# Altium schematic sheet ZYNQ_Schematic.SchDoc
size D; SheetNumber: 1; SheetTotal: 1; SPICEModelCacheHDNJRWBG: <root> / <DocumentId>HDNJRWBG</DocumentId> / </root>
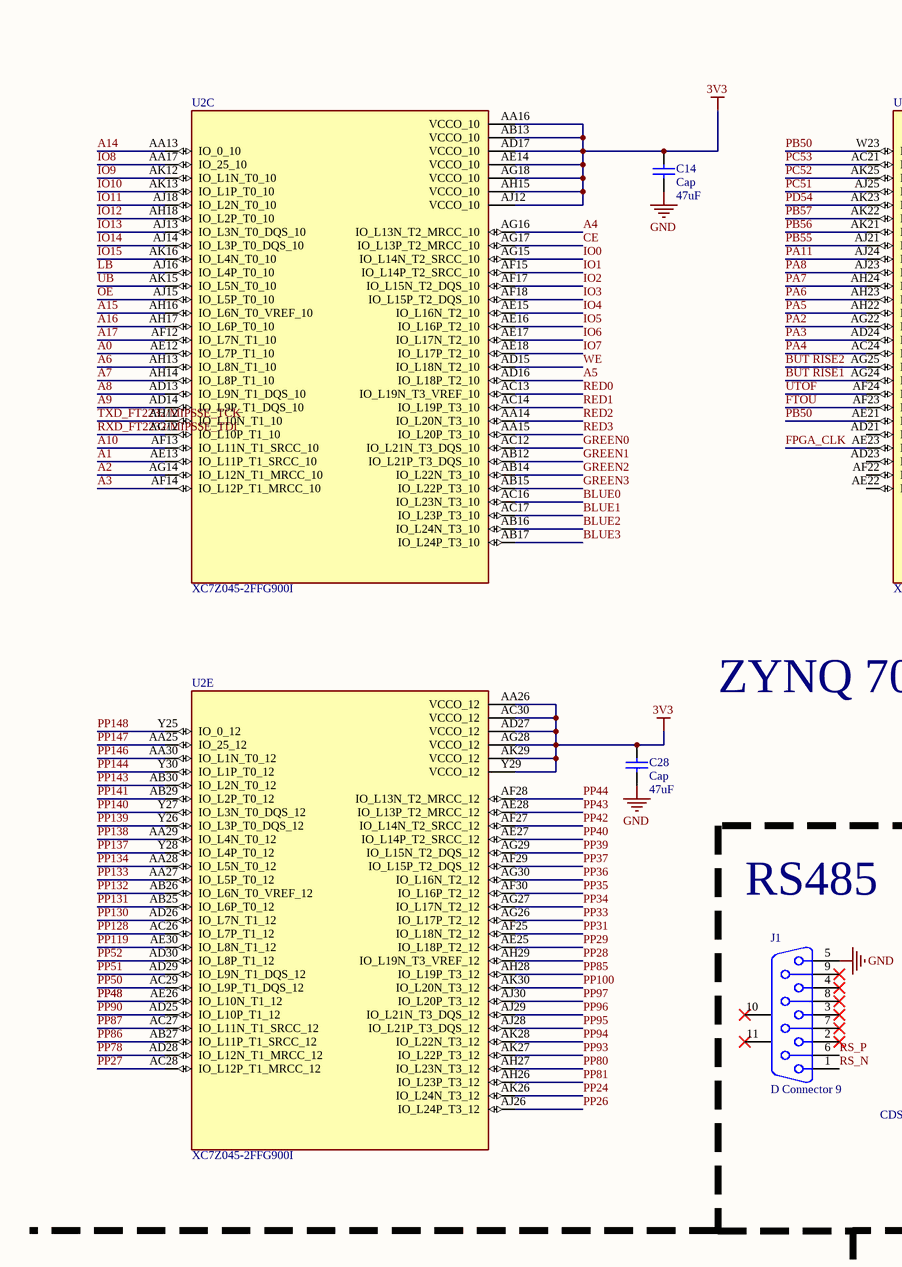
[diagram p0: ZYNQ_Schematic.SchDoc, top left]
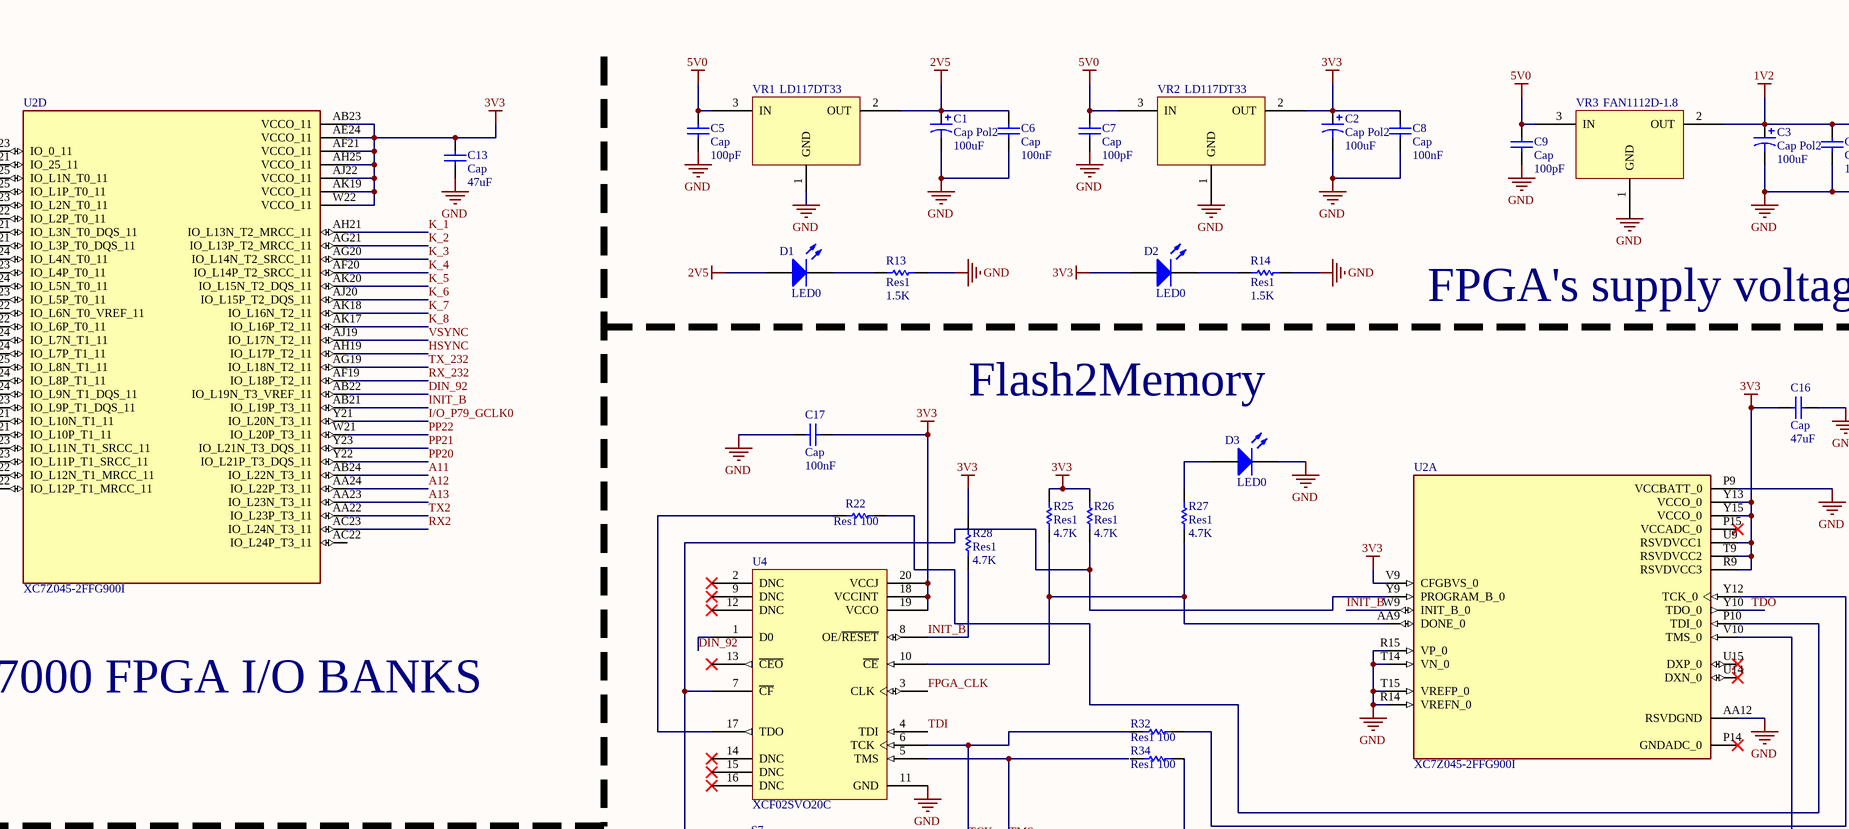
[diagram p1: ZYNQ_Schematic.SchDoc, top middle]
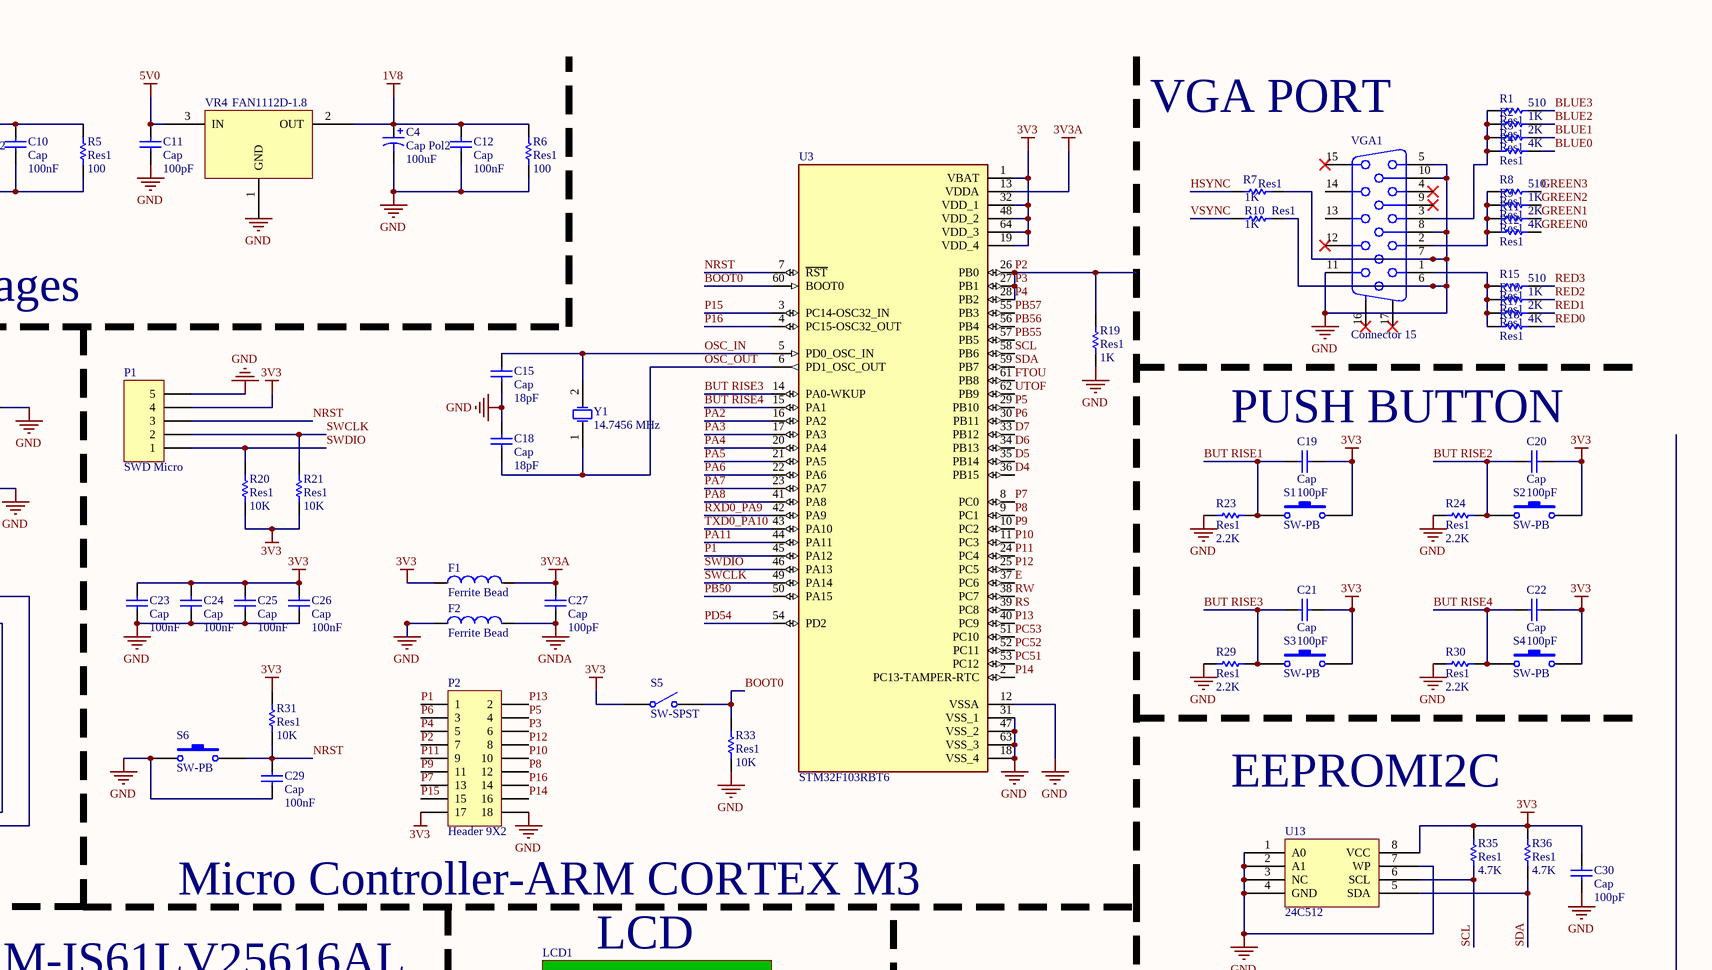
[diagram p2: ZYNQ_Schematic.SchDoc, top right]
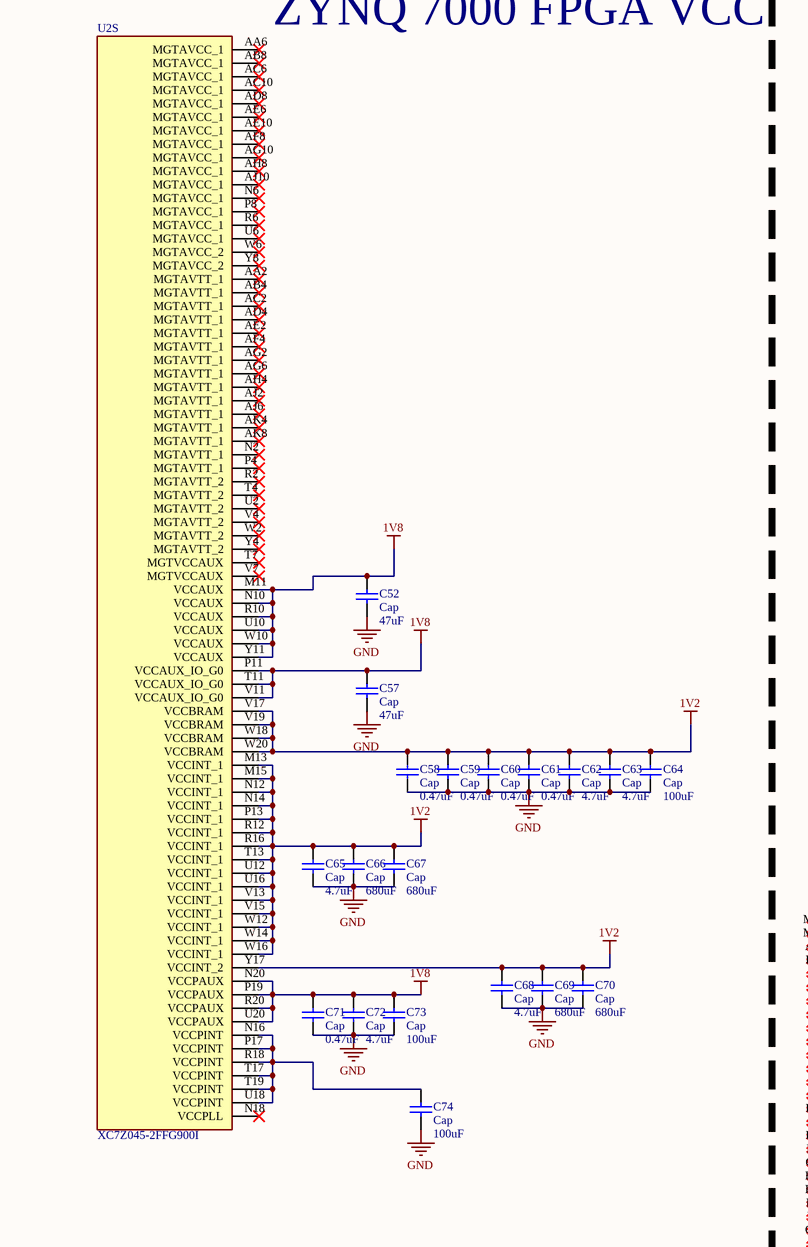
[diagram p3: ZYNQ_Schematic.SchDoc, bottom left]
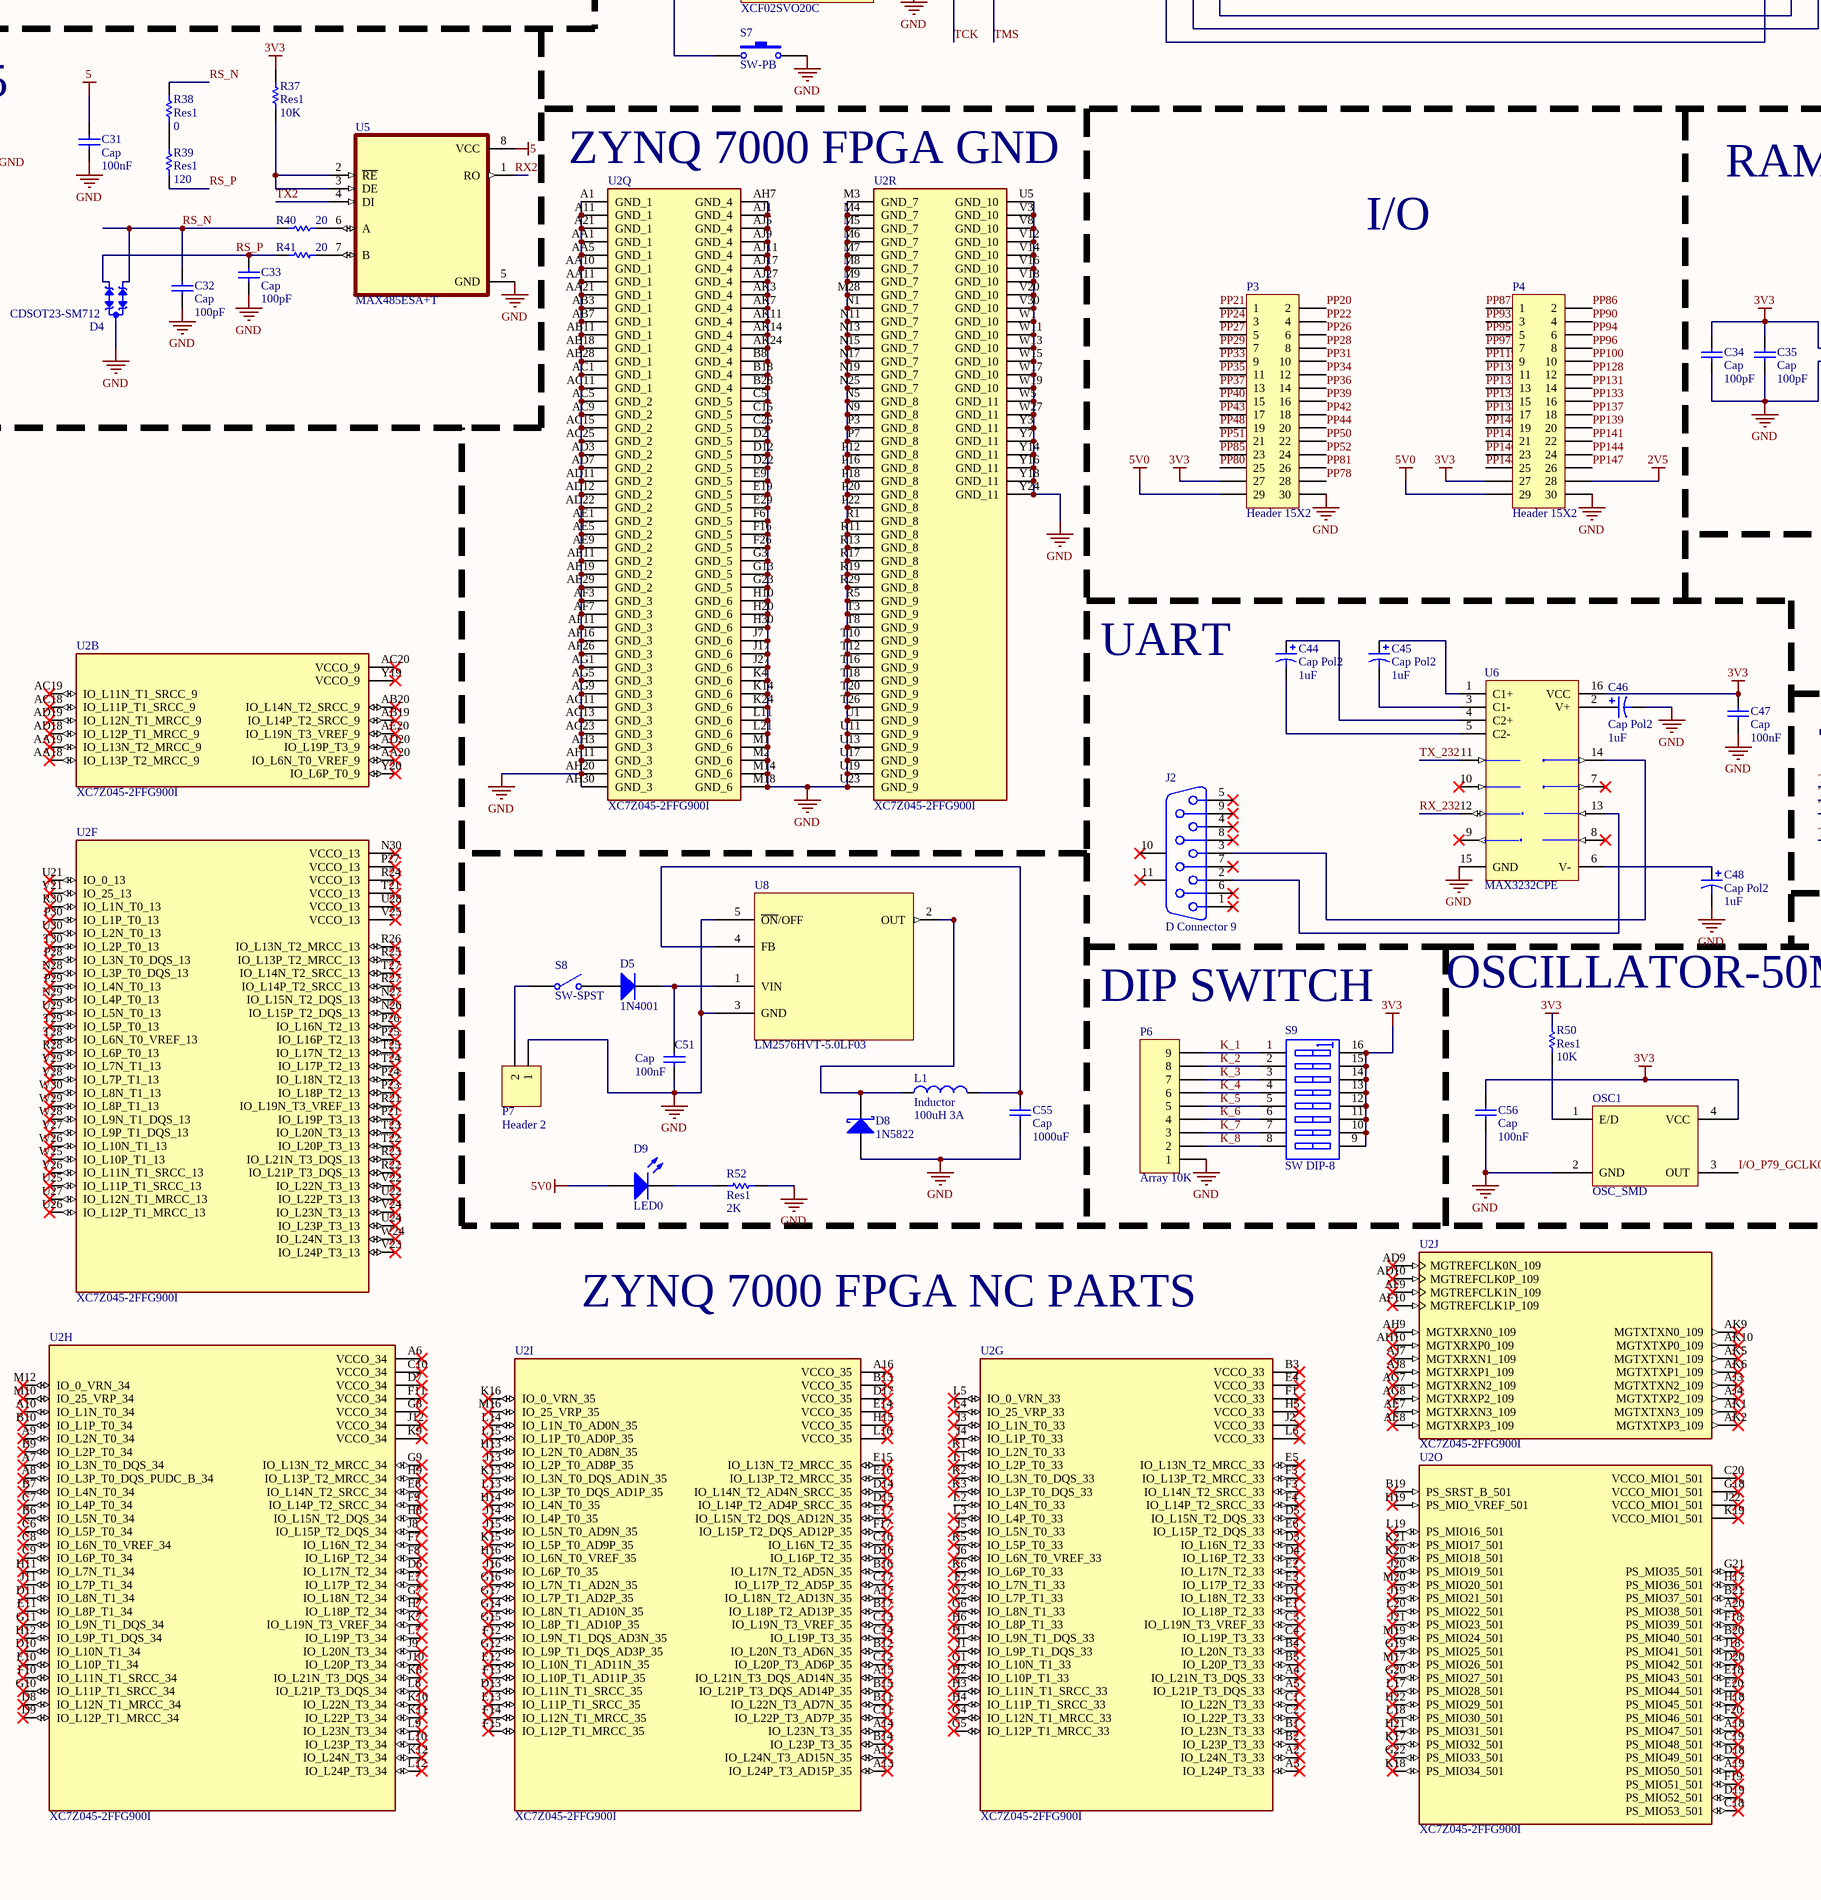
[diagram p4: ZYNQ_Schematic.SchDoc, bottom middle]
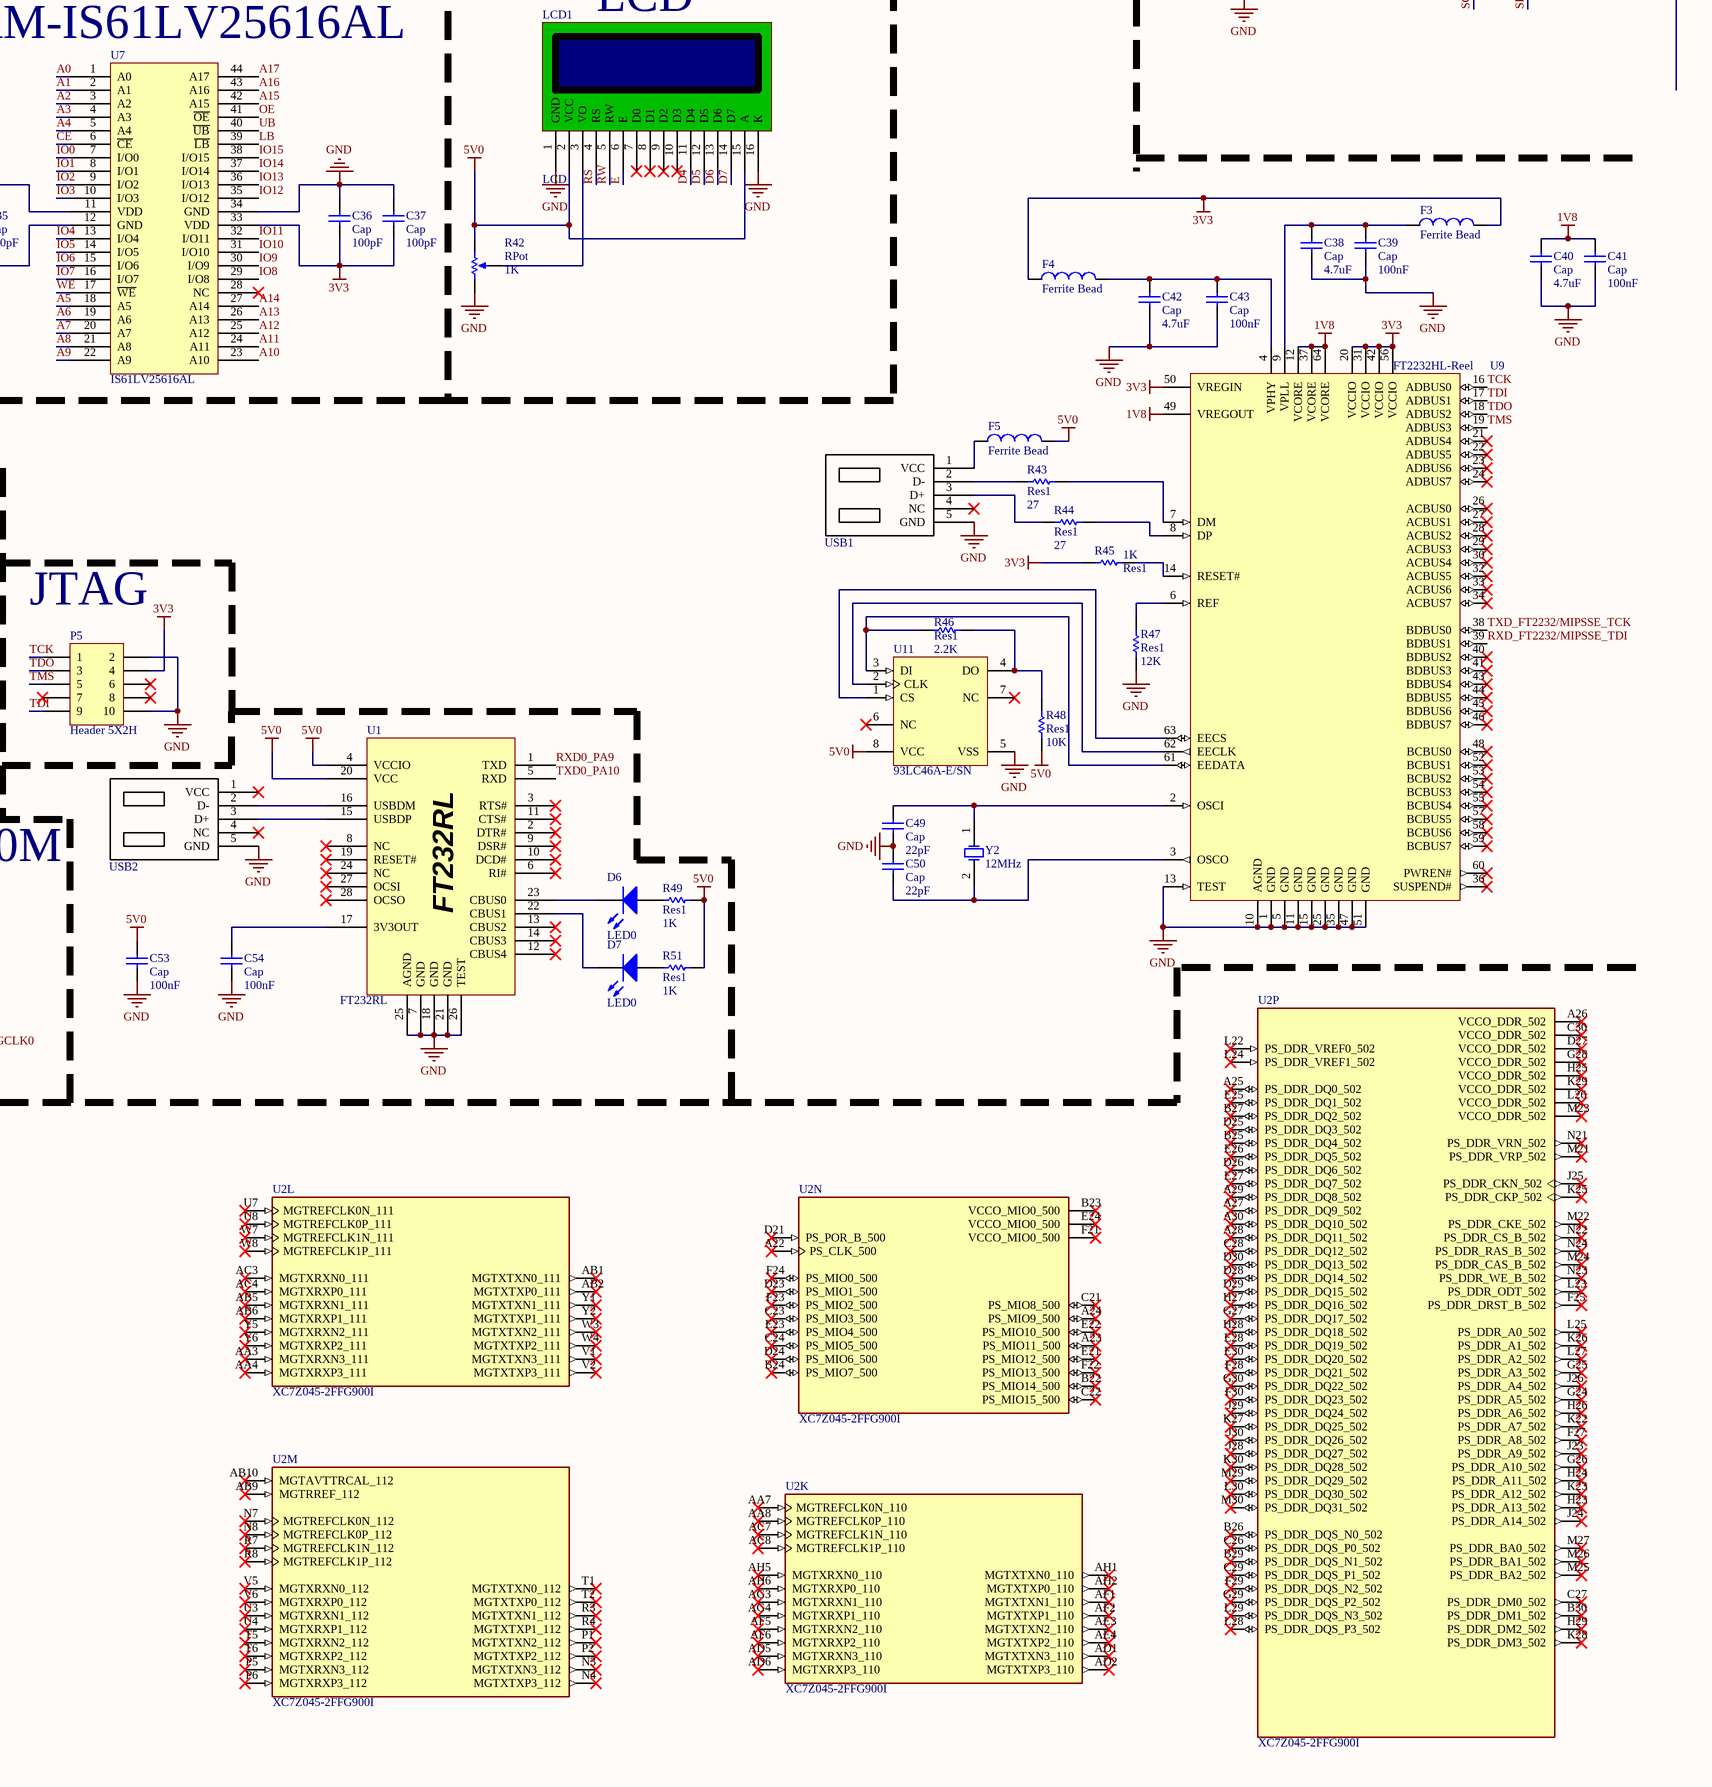
[diagram p5: ZYNQ_Schematic.SchDoc, bottom right]

## Parts
C1  Cap Pol2  value 100uF  [C_B]
C2  Cap Pol2  value 100uF  [C_B]
C3  Cap Pol2  value 100uF  [C_B]
C4  Cap Pol2  value 100uF  [C_B]
C5  Cap  value 100pF  [SMD_805]
C6  Cap  value 100nF  [SMD_805]
C7  Cap  value 100pF  [SMD_805]
C8  Cap  value 100nF  [SMD_805]
C9  Cap  value 100pF  [SMD_805]
C10  Cap  value 100nF  [SMD_805]
C11  Cap  value 100pF  [SMD_805]
C12  Cap  value 100nF  [SMD_805]
C13  Cap  value 47uF  [SMD_805]
C14  Cap  value 47uF  [SMD_805]
C15  Cap  value 18pF  [SMD_805]
C16  Cap  value 47uF  [SMD_805]
C17  Cap  value 100nF  [SMD_805]
C18  Cap  value 18pF  [SMD_805]
C19  Cap  value 100pF  [SMD_805]
C20  Cap  value 100pF  [SMD_805]
C21  Cap  value 100pF  [SMD_805]
C22  Cap  value 100pF  [SMD_805]
C23  Cap  value 100nF  [SMD_805]
C24  Cap  value 100nF  [SMD_805]
C25  Cap  value 100nF  [SMD_805]
C26  Cap  value 100nF  [SMD_805]
C27  Cap  value 100pF  [SMD_805]
C28  Cap  value 47uF  [SMD_805]
C29  Cap  value 100nF  [SMD_805]
C30  Cap  value 100pF  [SMD_805]
C31  Cap  value 100nF  [SMD_805]
C32  Cap  value 100pF  [SMD_805]
C33  Cap  value 100pF  [SMD_805]
C34  Cap  value 100pF  [SMD_805]
C35  Cap  value 100pF  [SMD_805]
C36  Cap  value 100pF  [SMD_805]
C37  Cap  value 100pF  [SMD_805]
C38  Cap  value 4.7uF  [SMD_805]
C39  Cap  value 100nF  [SMD_805]
C40  Cap  value 4.7uF  [SMD_805]
C41  Cap  value 100nF  [SMD_805]
C42  Cap  value 4.7uF  [SMD_805]
C43  Cap  value 100nF  [SMD_805]
C44  Cap Pol2  value 1uF  [C_B]
C45  Cap Pol2  value 1uF  [C_B]
C46  Cap Pol2  value 1uF  [C_B]
C47  Cap  value 100nF  [SMD_805]
C48  Cap Pol2  value 1uF  [C_B]
C49  Cap  value 22pF  [SMD_805]
C50  Cap  value 22pF  [SMD_805]
C51  Cap  value 100nF  [C_CYL_SMD2]
C52  Cap  value 47uF  [SMD_805]
C53  Cap  value 100nF  [SMD_805]
C54  Cap  value 100nF  [SMD_805]
C55  Cap  value 1000uF  [C_CYL_SMD]
C56  Cap  value 100nF  [SMD_805]
C57  Cap  value 47uF  [SMD_805]
C58  Cap  value 0.47uF  [SMD_805]
C59  Cap  value 0.47uF  [SMD_805]
C60  Cap  value 0.47uF  [SMD_805]
C61  Cap  value 0.47uF  [SMD_805]
C62  Cap  value 4.7uF  [SMD_805]
C63  Cap  value 4.7uF  [SMD_805]
C64  Cap  value 100uF  [SMD_805]
C65  Cap  value 4.7uF  [SMD_805]
C66  Cap  value 680uF  [SMD_805]
C67  Cap  value 680uF  [SMD_805]
C68  Cap  value 4.7uF  [SMD_805]
C69  Cap  value 680uF  [SMD_805]
C70  Cap  value 680uF  [SMD_805]
C71  Cap  value 0.47uF  [SMD_805]
C72  Cap  value 4.7uF  [SMD_805]
C73  Cap  value 100uF  [SMD_805]
C74  Cap  value 100uF  [SMD_805]
D1  LED0  [SMD_805]
D2  LED0  [SMD_805]
D3  LED0  [SMD_805]
D4  CDSOT23-SM712  [SOT23-3]
D5  1N4001  [TVS]
D6  LED0  [SMD_805]
D7  LED0  [SMD_805]
D8  1N5822  [1N5822]
D9  LED0  [SMD_805]
F1  Ferrite Bead  [SMD_805]
F2  Ferrite Bead  [SMD_805]
F3  Ferrite Bead  [SMD_805]
F4  Ferrite Bead  [SMD_805]
F5  Ferrite Bead  [SMD_805]
J1  D Connector 9  [COM_3d]
J2  D Connector 9  [COM_3d]
L1  Inductor  value 100uH 3A  [INDUC_SMD]
LCD1  LCD  [LCD2x16_3d]
OSC1  OSC_SMD  [OSC_SMD]
P1  SWD Micro  [HEADER5x1]
P2  Header 9X2  [HEADER10x2]
P3  Header 15X2  [HEADER15x2]
P4  Header 15X2  [HEADER15x2]
P5  Header 5X2H  [BOX2x5_3D]
P6  Array 10K  [ARRAY_RES]
P7  Header 2  [ADAP_JACK]
R1  Res1  value 510  [SMD_805]
R2  Res1  value 1K  [SMD_805]
R3  Res1  value 2K  [SMD_805]
R4  Res1  value 4K  [SMD_805]
R5  Res1  value 100  [SMD_805]
R6  Res1  value 100  [SMD_805]
R7  Res1  value 1K  [SMD_805]
R8  Res1  value 510  [SMD_805]
R9  Res1  value 1K  [SMD_805]
R10  Res1  value 1K  [SMD_805]
R11  Res1  value 2K  [SMD_805]
R12  Res1  value 4K  [SMD_805]
R13  Res1  value 1.5K  [SMD_805]
R14  Res1  value 1.5K  [SMD_805]
R15  Res1  value 510  [SMD_805]
R16  Res1  value 1K  [SMD_805]
R17  Res1  value 2K  [SMD_805]
R18  Res1  value 4K  [SMD_805]
R19  Res1  value 1K  [SMD_805]
R20  Res1  value 10K  [SMD_805]
R21  Res1  value 10K  [SMD_805]
R22  Res1  value 100  [SMD_805]
R23  Res1  value 2.2K  [SMD_805]
R24  Res1  value 2.2K  [SMD_805]
R25  Res1  value 4.7K  [SMD_805]
R26  Res1  value 4.7K  [SMD_805]
R27  Res1  value 4.7K  [SMD_805]
R28  Res1  value 4.7K  [SMD_805]
R29  Res1  value 2.2K  [SMD_805]
R30  Res1  value 2.2K  [SMD_805]
R31  Res1  value 10K  [SMD_805]
R32  Res1  value 100  [SMD_805]
R33  Res1  value 10K  [SMD_805]
R34  Res1  value 100  [SMD_805]
R35  Res1  value 4.7K  [SMD_805]
R36  Res1  value 4.7K  [SMD_805]
R37  Res1  value 10K  [SMD_805]
R38  Res1  value 0  [SMD_805]
R39  Res1  value 120  [SMD_805]
R40  value 20  [SMD_805]  (hidden comment: Res1)
R41  value 20  [SMD_805]  (hidden comment: Res1)
R42  RPot  value 1K  [VR5]
R43  Res1  value 27  [SMD_805]
R44  Res1  value 27  [SMD_805]
R45  Res1  value 1K  [SMD_805]
R46  Res1  value 2.2K  [SMD_805]
R47  Res1  value 12K  [SMD_805]
R48  Res1  value 10K  [SMD_805]
R49  Res1  value 1K  [SMD_805]
R50  Res1  value 10K  [SMD_805]
R51  Res1  value 1K  [SMD_805]
R52  Res1  value 2K  [SMD_805]
S1  SW-PB  [RES_B]
S2  SW-PB  [RES_B]
S3  SW-PB  [RES_B]
S4  SW-PB  [RES_B]
S5  SW-SPST  [SPST-2]
S6  SW-PB  [RES_B]
S7  SW-PB  [RES_B]
S8  SW-SPST  [SPST-2]
S9  SW DIP-8  [ARRAY_KEY8]
U1  FT232RL  [FT232RL]
U2  XC7Z045-2FFG900I  [IC_XC7Z045-2FFG900I]  (parts A,B,C,D,E,F,G,H,I,J,K,L,M,N,O,P,Q,R,S of 19)
U3  STM32F103RBT6  [LQFP64_L]
U4  XCF02SVO20C  [XCF02S]
U5  MAX485ESA+T  [SOIC127P600X175-8N]
U6  MAX3232CPE  [max3232]
U7  IS61LV25616AL  [IS61LV256]
U8  LM2576HVT-5.0LF03  [T05A_TEX]
U9  FT2232HL-Reel  [LQFP64_L]
U11  93LC46A-E/SN  [SOIC-SN8_N]
U13  24C512  [24C512]
USB1  MICRO_USB  [MINI_USB_NEW]  (value not drawn)
USB2  MICRO_USB  [MINI_USB_NEW]  (value not drawn)
VGA1  Connector 15  [VGA_PORT]
VR1  Voltage Regulator  [SOT223]  (value not drawn)
VR2  Voltage Regulator  [SOT223]  (value not drawn)
VR3  Voltage_Reg_Fan  [SOT223]  (value not drawn)
VR4  Voltage_Reg_Fan  [SOT223]  (value not drawn)
Y1  14.7456 MHz  [BCY-W2/D3.1]
Y2  12MHz  [BCY-W2/D3.1]

## Nets
1V2: C3.1 C10.2 C58.2 C59.2 C60.2 C61.2 C62.2 C63.2 C64.2 C65.2 C66.2 C67.2 C68.2 C69.2 C70.2 R5.2 U2.M13(VCCINT_1) U2.M15(VCCINT_1) U2.N12(VCCINT_1) U2.N14(VCCINT_1) U2.P13(VCCINT_1) U2.R12(VCCINT_1) U2.R16(VCCINT_1) U2.T13(VCCINT_1) U2.U12(VCCINT_1) U2.U16(VCCINT_1) U2.V13(VCCINT_1) U2.V15(VCCINT_1) U2.V17(VCCBRAM) U2.V19(VCCBRAM) U2.W12(VCCINT_1) U2.W14(VCCINT_1) U2.W16(VCCINT_1) U2.W18(VCCBRAM) U2.W20(VCCBRAM) U2.Y17(VCCINT_2) VR3.2(OUT)
1V8: C4.1 C12.2 C40.1 C41.1 C52.2 C57.2 C71.2 C72.2 C73.2 R6.2 U2.M11(VCCAUX) U2.N10(VCCAUX) U2.N20(VCCPAUX) U2.P11(VCCAUX_IO_G0) U2.P19(VCCPAUX) U2.R10(VCCAUX) U2.R20(VCCPAUX) U2.T11(VCCAUX_IO_G0) U2.U10(VCCAUX) U2.U20(VCCPAUX) U2.V11(VCCAUX_IO_G0) U2.W10(VCCAUX) U2.Y11(VCCAUX) U9.12(VCORE) U9.37(VCORE) U9.49(VREGOUT) U9.64(VCORE) VR4.2(OUT)
2V5: C1.1 C6.2 D1.1(A) P4.28 VR1.2(OUT)
3V3: C2.1 C8.2 C13.2 C14.2 C16.2 C17.1 C19.2 C20.2 C21.2 C22.2 C23.2 C24.2 C25.2 C26.2 C28.2 C30.2 C34.2 C35.2 C36.1 C37.1 C47.1 C56.2 D2.1(A) F1.1 F3.2 F4.1 OSC1.4(VCC) P1.4 P2.17 P3.27 P4.27 P5.4 R20.2 R21.2 R25.1 R26.1 R28.1 R31.1 R35.2 R36.2 R37.2 R45.2 R50.2 S1.2 S2.2 S3.2 S4.2 S5.1(COMMON) S9.9(B8) S9.10(B7) S9.11(B6) S9.12(B5) S9.13(B4) S9.14(B3) S9.15(B2) S9.16(B1) U2.AA16(VCCO_10) U2.AA26(VCCO_12) U2.AB13(VCCO_10) U2.AB23(VCCO_11) U2.AC30(VCCO_12) U2.AD17(VCCO_10) U2.AD27(VCCO_12) U2.AE14(VCCO_10) U2.AE24(VCCO_11) U2.AF21(VCCO_11) U2.AG18(VCCO_10) U2.AG28(VCCO_12) U2.AH15(VCCO_10) U2.AH25(VCCO_11) U2.AJ12(VCCO_10) U2.AJ22(VCCO_11) U2.AK19(VCCO_11) U2.AK29(VCCO_12) U2.R9(RSVDVCC3) U2.T9(RSVDVCC2) U2.U9(RSVDVCC1) U2.V9(CFGBVS_0) U2.W22(VCCO_11) U2.Y13(VCCO_0) U2.Y15(VCCO_0) U2.Y29(VCCO_12) U3.1(VBAT) U3.19(VDD_4) U3.32(VDD_1) U3.48(VDD_2) U3.64(VDD_3) U4.18(VCCINT) U4.19(VCCO) U4.20(VCCJ) U6.16(VCC) U7.11(VDD) U7.33(VDD) U9.20(VCCIO) U9.31(VCCIO) U9.42(VCCIO) U9.50(VREGIN) U9.56(VCCIO) U13.8(VCC) VR2.2(OUT)
3V3A: C27.1 F1.2 U3.13(VDDA)
5: C31.2 U5.8(VCC)
5V0: C5.2 C7.2 C9.2 C11.2 C53.1 D9.1(A) F5.2 LCD1.2(VCC) LCD1.15(A) P3.29 P4.29 R42.2(BOT) R48.2 R49.1 R51.1 U1.4(VCCIO) U1.20(VCC) U11.8(VCC) VR1.3(IN) VR2.3(IN) VR3.3(IN) VR4.3(IN)
GND: C1.2 C2.2 C3.2 C4.2 C5.1 C6.1 C7.1 C8.1 C9.1 C10.1 C11.1 C12.1 C13.1 C14.1 C15.1 C16.1 C17.2 C18.2 C23.1 C24.1 C25.1 C26.1 C28.1 C29.1 C30.1 C31.1 C32.1 C33.1 C34.1 C35.1 C36.2 C37.2 C38.2 C39.2 C40.2 C41.2 C42.2 C43.2 C46.2 C47.2 C48.2 C49.1 C50.2 C51.2 C52.1 C53.2 C54.2 C55.1 C56.1 C57.1 C58.1 C59.1 C60.1 C61.1 C62.1 C63.1 C64.1 C65.1 C66.1 C67.1 C68.1 C69.1 C70.1 C71.1 C72.1 C73.1 C74.1 D3.2(K) D4.3(P$3) D8.1(A) F2.1 J1.5 LCD1.1(GND) LCD1.16(K) OSC1.2(GND) P1.5 P2.18 P3.30 P4.30 P5.2 P5.10 P6.1 P7.1 R5.1 R6.1 R7.2 R10.2 R13.2 R14.2 R19.2 R23.1 R24.1 R29.1 R30.1 R33.2 R42.1(TOP) R47.2 R52.2 S6.1 S7.2 U1.7(GND) U1.18(GND) U1.21(GND) U1.25(AGND) U1.26(TEST) U2.A1(GND_1) U2.A11(GND_1) U2.A21(GND_1) U2.AA1(GND_1) U2.AA5(GND_1) U2.AA10(GND_1) U2.AA11(GND_1) U2.AA12(RSVDGND) U2.AA21(GND_1) U2.AB3(GND_1) U2.AB7(GND_1) U2.AB11(GND_1) U2.AB18(GND_1) U2.AB28(GND_1) U2.AC1(GND_1) U2.AC5(GND_2) U2.AC9(GND_2) U2.AC11(GND_1) U2.AC15(GND_2) U2.AC25(GND_2) U2.AD3(GND_2) U2.AD7(GND_2) U2.AD11(GND_2) U2.AD12(GND_2) U2.AD22(GND_2) U2.AE1(GND_2) U2.AE5(GND_2) U2.AE9(GND_2) U2.AE11(GND_2) U2.AE19(GND_2) U2.AE29(GND_2) U2.AF3(GND_3) U2.AF7(GND_3) U2.AF11(GND_3) U2.AF16(GND_3) U2.AF26(GND_3) U2.AG1(GND_3) U2.AG5(GND_3) U2.AG9(GND_3) U2.AG11(GND_3) U2.AG13(GND_3) U2.AG23(GND_3) U2.AH3(GND_3) U2.AH7(GND_4) U2.AH11(GND_3) U2.AH20(GND_3) U2.AH30(GND_3) U2.AJ1(GND_4) U2.AJ5(GND_4) U2.AJ9(GND_4) U2.AJ11(GND_4) U2.AJ17(GND_4) U2.AJ27(GND_4) U2.AK3(GND_4) U2.AK7(GND_4) U2.AK11(GND_4) U2.AK14(GND_4) U2.AK24(GND_4) U2.B8(GND_4) U2.B18(GND_4) U2.B28(GND_4) U2.C5(GND_5) U2.C15(GND_5) U2.C25(GND_5) U2.D2(GND_5) U2.D12(GND_5) U2.D22(GND_5) U2.E9(GND_5) U2.E19(GND_5) U2.E29(GND_5) U2.F6(GND_5) U2.F16(GND_5) U2.F26(GND_5) U2.G3(GND_5) U2.G13(GND_5) U2.G23(GND_5) U2.H10(GND_6) U2.H20(GND_6) U2.H30(GND_6) U2.J7(GND_6) U2.J17(GND_6) U2.J27(GND_6) U2.K4(GND_6) U2.K14(GND_6) U2.K24(GND_6) U2.L11(GND_6) U2.L21(GND_6) U2.M1(GND_6) U2.M2(GND_6) U2.M3(GND_7) U2.M4(GND_7) U2.M5(GND_7) U2.M6(GND_7) U2.M7(GND_7) U2.M8(GND_7) U2.M9(GND_7) U2.M14(GND_6) U2.M18(GND_6) U2.M28(GND_7) U2.N1(GND_7) U2.N5(GND_8) U2.N9(GND_8) U2.N11(GND_7) U2.N13(GND_7) U2.N15(GND_7) U2.N17(GND_7) U2.N19(GND_7) U2.N25(GND_7) U2.P3(GND_8) U2.P7(GND_8) U2.P9(VCCBATT_0) U2.P12(GND_8) U2.P16(GND_8) U2.P18(GND_8) U2.P20(GND_8) U2.P22(GND_8) U2.R1(GND_8) U2.R5(GND_9) U2.R11(GND_8) U2.R13(GND_8) U2.R14(VREFN_0) U2.R15(VP_0) U2.R17(GND_8) U2.R19(GND_8) U2.R29(GND_8) U2.T3(GND_9) U2.T8(GND_9) U2.T10(GND_9) U2.T12(GND_9) U2.T14(VN_0) U2.T15(VREFP_0) U2.T16(GND_9) U2.T18(GND_9) U2.T20(GND_9) U2.T26(GND_9) U2.U1(GND_9) U2.U5(GND_10) U2.U11(GND_9) U2.U13(GND_9) U2.U17(GND_9) U2.U19(GND_9) U2.U23(GND_9) U2.V3(GND_10) U2.V8(GND_10) U2.V12(GND_10) U2.V14(GND_10) U2.V16(GND_10) U2.V18(GND_10) U2.V20(GND_10) U2.V30(GND_10) U2.W1(GND_10) U2.W5(GND_11) U2.W11(GND_10) U2.W13(GND_10) U2.W15(GND_10) U2.W17(GND_10) U2.W19(GND_10) U2.W27(GND_11) U2.Y3(GND_11) U2.Y7(GND_11) U2.Y14(GND_11) U2.Y16(GND_11) U2.Y18(GND_11) U2.Y24(GND_11) U3.12(VSSA) U3.18(VSS_4) U3.31(VSS_1) U3.47(VSS_2) U3.63(VSS_3) U4.11(GND) U5.5(GND) U6.15(GND) U7.12(GND) U7.34(GND) U8.3(GND) U8.5(~{ON}/OFF) U9.1(GND) U9.5(GND) U9.10(AGND) U9.11(GND) U9.13(TEST) U9.15(GND) U9.25(GND) U9.35(GND) U9.47(GND) U9.51(GND) U11.5(VSS) U13.1(A0) U13.2(A1) U13.3(NC) U13.4(GND) U13.7(WP) USB1.5(GND) USB2.5(GND) VGA1.5 VGA1.6 VGA1.7 VGA1.8 VGA1.10 VGA1.11 VR1.1(GND)
GNDA: C27.2 F2.2
A0: U2.AE12(IO_L7P_T1_10) U7.1(A0)
A1: U2.AE13(IO_L11P_T1_SRCC_10) U7.2(A1)
A2: U2.AG14(IO_L12N_T1_MRCC_10) U7.3(A2)
A3: U2.AF14(IO_L12P_T1_MRCC_10) U7.4(A3)
A4: U2.AG16(IO_L13N_T2_MRCC_10) U7.5(A4)
A5: U2.AD16(IO_L18P_T2_10) U7.18(A5)
A6: U2.AH13(IO_L8N_T1_10) U7.19(A6)
A7: U2.AH14(IO_L8P_T1_10) U7.20(A7)
A8: U2.AD13(IO_L9N_T1_DQS_10) U7.21(A8)
A9: U2.AD14(IO_L9P_T1_DQS_10) U7.22(A9)
A10: U2.AF13(IO_L11N_T1_SRCC_10) U7.23(A10)
A11: U2.AB24(IO_L22N_T3_11) U7.24(A11)
A12: U2.AA24(IO_L22P_T3_11) U7.25(A12)
A13: U2.AA23(IO_L23N_T3_11) U7.26(A13)
A14: U2.AA13(IO_0_10) U7.27(A14)
A15: U2.AH16(IO_L6N_T0_VREF_10) U7.42(A15)
A16: U2.AH17(IO_L6P_T0_10) U7.43(A16)
A17: U2.AF12(IO_L7N_T1_10) U7.44(A17)
BLUE0: R4.2 U2.AC16(IO_L23N_T3_10)
BLUE1: R3.2 U2.AC17(IO_L23P_T3_10)
BLUE2: R2.2 U2.AB16(IO_L24N_T3_10)
BLUE3: R1.2 U2.AB17(IO_L24P_T3_10)
BOOT0: R33.1 S5.2(NO) U3.60(BOOT0)
BUT RISE1: C19.1 R23.2 S1.1 U2.AG24(IO_L8P_T1_11)
BUT RISE2: C20.1 R24.2 S2.1 U2.AG25(IO_L8N_T1_11)
BUT RISE3: C21.1 R29.2 S3.1 U3.14(PA0-WKUP)
BUT RISE4: C22.1 R30.2 S4.1 U3.15(PA1)
CE: U2.AG17(IO_L13P_T2_MRCC_10) U7.6(~{CE})
D4: LCD1.11(D4) U3.36(PB15)
D5: LCD1.12(D5) U3.35(PB14)
D6: LCD1.13(D6) U3.34(PB13)
D7: LCD1.14(D7) U3.33(PB12)
DIN_92: U2.AB22(IO_L19N_T3_VREF_11) U4.1(D0)
E: LCD1.6(E) U3.37(PC6)
FPGA_CLK: U2.AE23(IO_L11N_T1_SRCC_11) U4.3(CLK)
FTOU: U2.AF23(IO_L9P_T1_DQS_11) U3.61(PB8)
GREEN0: R12.2 U2.AC12(IO_L21N_T3_DQS_10)
GREEN1: R11.2 U2.AB12(IO_L21P_T3_DQS_10)
GREEN2: R9.2 U2.AB14(IO_L22N_T3_10)
GREEN3: R8.2 U2.AB15(IO_L22P_T3_10)
HSYNC: R7.1 U2.AH19(IO_L17P_T2_11)
I/O_P79_GCLK0: OSC1.3(OUT) U2.Y21(IO_L20N_T3_11)
INIT_B: R28.2 U2.AB21(IO_L19P_T3_11) U2.W9(INIT_B_0) U4.8(OE/~{RE}~{S}~{E}~{T})
IO0: U2.AG15(IO_L14N_T2_SRCC_10) U7.7(I/O0)
IO1: U2.AF15(IO_L14P_T2_SRCC_10) U7.8(I/O1)
IO2: U2.AF17(IO_L15N_T2_DQS_10) U7.9(I/O2)
IO3: U2.AF18(IO_L15P_T2_DQS_10) U7.10(I/O3)
IO4: U2.AE15(IO_L16N_T2_10) U7.13(I/O4)
IO5: U2.AE16(IO_L16P_T2_10) U7.14(I/O5)
IO6: U2.AE17(IO_L17N_T2_10) U7.15(I/O6)
IO7: U2.AE18(IO_L17P_T2_10) U7.16(I/O7)
IO8: U2.AA17(IO_25_10) U7.29(I/O8)
IO9: U2.AK12(IO_L1N_T0_10) U7.30(I/O9)
IO10: U2.AK13(IO_L1P_T0_10) U7.31(I/O10)
IO11: U2.AJ18(IO_L2N_T0_10) U7.32(I/O11)
IO12: U2.AH18(IO_L2P_T0_10) U7.35(I/O12)
IO13: U2.AJ13(IO_L3N_T0_DQS_10) U7.36(I/O13)
IO14: U2.AJ14(IO_L3P_T0_DQS_10) U7.37(I/O14)
IO15: U2.AK16(IO_L4N_T0_10) U7.38(I/O15)
K_1: P6.9 S9.1(A1) U2.AH21(IO_L13N_T2_MRCC_11)
K_2: P6.8 S9.2(A2) U2.AG21(IO_L13P_T2_MRCC_11)
K_3: P6.7 S9.3(A3) U2.AG20(IO_L14N_T2_SRCC_11)
K_4: P6.6 S9.4(A4) U2.AF20(IO_L14P_T2_SRCC_11)
K_5: P6.5 S9.5(A5) U2.AK20(IO_L15N_T2_DQS_11)
K_6: P6.4 S9.6(A6) U2.AJ20(IO_L15P_T2_DQS_11)
K_7: P6.3 S9.7(A7) U2.AK18(IO_L16N_T2_11)
K_8: P6.2 S9.8(A8) U2.AK17(IO_L16P_T2_11)
LB: U2.AJ16(IO_L4P_T0_10) U7.39(~{LB})
NRST: C29.2 P1.3 R31.2 S6.2 U3.7(~{RST})
OE: U2.AJ15(IO_L5P_T0_10) U7.41(~{OE})
OSC_IN: C15.2 U3.5(PD0_OSC_IN) Y1.2(OSC2)
OSC_OUT: C18.1 U3.6(PD1_OSC_OUT) Y1.1(OSC1)
P1: P2.1 U3.45(PA12)
P2: P2.5 P2.6 P2.7 R19.1 U3.26(PB0) U3.27(PB1) U3.28(PB2)  [also labelled P3, P4]
P5: P2.4 U3.29(PB10)
P6: P2.3 U3.30(PB11)
P7: P2.13 U3.8(PC0)
P8: P2.12 U3.9(PC1)
P9: P2.11 U3.10(PC2)
P10: P2.10 U3.11(PC3)
P11: P2.9 U3.24(PC4)
P12: P2.8 U3.25(PC5)
P13: P2.2 U3.40(PC9)
P14: P2.16 U3.2(PC13-TAMPER-RTC)
P15: P2.15 U3.3(PC14-OSC32_IN)
P16: P2.14 U3.4(PC15-OSC32_OUT)
PA2: U2.AG22(IO_L6P_T0_11) U3.16(PA2)
PA3: U2.AD24(IO_L7N_T1_11) U3.17(PA3)
PA4: U2.AC24(IO_L7P_T1_11) U3.20(PA4)
PA5: U2.AH22(IO_L6N_T0_VREF_11) U3.21(PA5)
PA6: U2.AH23(IO_L5P_T0_11) U3.22(PA6)
PA7: U2.AH24(IO_L5N_T0_11) U3.23(PA7)
PA8: U2.AJ23(IO_L4P_T0_11) U3.41(PA8)
PA11: U2.AJ24(IO_L4N_T0_11) U3.44(PA11)
PB50: U2.AE21(IO_L10N_T1_11) U2.W23(IO_0_11) U3.50(PA15)
PB55: U2.AJ21(IO_L3P_T0_DQS_11) U3.57(PB5)
PB56: U2.AK21(IO_L3N_T0_DQS_11) U3.56(PB4)
PB57: U2.AK22(IO_L2P_T0_11) U3.55(PB3)
PC51: U2.AJ25(IO_L1P_T0_11) U3.53(PC12)
PC52: U2.AK25(IO_L1N_T0_11) U3.52(PC11)
PC53: U2.AC21(IO_25_11) U3.51(PC10)
PD54: U2.AK23(IO_L2N_T0_11) U3.54(PD2)
PP20: P3.2 U2.Y22(IO_L21P_T3_DQS_11)
PP21: P3.1 U2.Y23(IO_L21N_T3_DQS_11)
PP22: P3.4 U2.W21(IO_L20P_T3_11)
PP24: P3.3 U2.AK26(IO_L24N_T3_12)
PP26: P3.6 U2.AJ26(IO_L24P_T3_12)
PP27: P3.5 U2.AC28(IO_L12P_T1_MRCC_12)
PP28: P3.8 U2.AH29(IO_L19N_T3_VREF_12)
PP29: P3.7 U2.AE25(IO_L18P_T2_12)
PP31: P3.10 U2.AF25(IO_L18N_T2_12)
PP33: P3.9 U2.AG26(IO_L17P_T2_12)
PP34: P3.12 U2.AG27(IO_L17N_T2_12)
PP35: P3.11 U2.AF30(IO_L16P_T2_12)
PP36: P3.14 U2.AG30(IO_L16N_T2_12)
PP37: P3.13 U2.AF29(IO_L15P_T2_DQS_12)
PP39: P3.16 U2.AG29(IO_L15N_T2_DQS_12)
PP40: P3.15 U2.AE27(IO_L14P_T2_SRCC_12)
PP42: P3.18 U2.AF27(IO_L14N_T2_SRCC_12)
PP43: P3.17 U2.AE28(IO_L13P_T2_MRCC_12)
PP44: P3.20 U2.AF28(IO_L13N_T2_MRCC_12)
PP48: P3.19 U2.AE26(IO_L10N_T1_12)
PP50: P3.22 U2.AC29(IO_L9P_T1_DQS_12)
PP51: P3.21 U2.AD29(IO_L9N_T1_DQS_12)
PP52: P3.24 U2.AD30(IO_L8P_T1_12)
PP78: P3.28 U2.AD28(IO_L12N_T1_MRCC_12)
PP80: P3.25 U2.AH27(IO_L23N_T3_12)
PP81: P3.26 U2.AH26(IO_L23P_T3_12)
PP85: P3.23 U2.AH28(IO_L19P_T3_12)
PP86: P4.2 U2.AB27(IO_L11P_T1_SRCC_12)
PP87: P4.1 U2.AC27(IO_L11N_T1_SRCC_12)
PP90: P4.4 U2.AD25(IO_L10P_T1_12)
PP93: P4.3 U2.AK27(IO_L22P_T3_12)
PP94: P4.6 U2.AK28(IO_L22N_T3_12)
PP95: P4.5 U2.AJ28(IO_L21P_T3_DQS_12)
PP96: P4.8 U2.AJ29(IO_L21N_T3_DQS_12)
PP97: P4.7 U2.AJ30(IO_L20P_T3_12)
PP100: P4.10 U2.AK30(IO_L20N_T3_12)
PP119: P4.9 U2.AE30(IO_L8N_T1_12)
PP128: P4.12 U2.AC26(IO_L7P_T1_12)
PP130: P4.11 U2.AD26(IO_L7N_T1_12)
PP131: P4.14 U2.AB25(IO_L6P_T0_12)
PP132: P4.13 U2.AB26(IO_L6N_T0_VREF_12)
PP133: P4.16 U2.AA27(IO_L5P_T0_12)
PP134: P4.15 U2.AA28(IO_L5N_T0_12)
PP137: P4.18 U2.Y28(IO_L4P_T0_12)
PP138: P4.17 U2.AA29(IO_L4N_T0_12)
PP139: P4.20 U2.Y26(IO_L3P_T0_DQS_12)
PP140: P4.19 U2.Y27(IO_L3N_T0_DQS_12)
PP141: P4.22 U2.AB29(IO_L2P_T0_12)
PP143: P4.21 U2.AB30(IO_L2N_T0_12)
PP144: P4.24 U2.Y30(IO_L1P_T0_12)
PP146: P4.23 U2.AA30(IO_L1N_T0_12)
PP147: P4.26 U2.AA25(IO_25_12)
PP148: P4.25 U2.Y25(IO_0_12)
RED0: R18.2 U2.AC13(IO_L19N_T3_VREF_10)
RED1: R17.2 U2.AC14(IO_L19P_T3_10)
RED2: R16.2 U2.AA14(IO_L20N_T3_10)
RED3: R15.2 U2.AA15(IO_L20P_T3_10)
RS: LCD1.4(RS) U3.39(PC8)
RS_N: C32.2 D4.1(P$1) J1.1 R38.2 R40.2
RS_P: C33.2 D4.2(P$2) J1.6 R39.1 R41.2
RW: LCD1.5(RW) U3.38(PC7)
RX2: U2.AC23(IO_L24N_T3_11) U5.1(RO)
RX_232: U2.AF19(IO_L18P_T2_11) U6.12(R1OUT)
RXD0_PA9: U1.1(TXD) U3.42(PA9)
RXD_FT2232/MIPSSE_TDI: U2.AG12(IO_L10P_T1_10) U9.39(BDBUS1)
SCL: R35.1 U3.58(PB6) U13.6(SCL)
SDA: R36.1 U3.59(PB7) U13.5(SDA)
SWCLK: P1.2 R21.1 U3.49(PA14)
SWDIO: P1.1 R20.1 U3.46(PA13)
TCK: P5.1 R32.2 U4.6(TCK) U9.16(ADBUS0)
TDI: P5.9 U4.4(TDI) U9.17(ADBUS1)
TDO: P5.3 U2.Y10(TDO_0) U9.18(ADBUS2)
TMS: P5.5 U4.5(TMS) U9.19(ADBUS3)
TX2: U2.AA22(IO_L23P_T3_11) U5.4(DI)
TX_232: U2.AG19(IO_L18N_T2_11) U6.11(T1IN)
TXD0_PA10: U1.5(RXD) U3.43(PA10)
TXD_FT2232/MIPSSE_TCK: U2.AH12(IO_L10N_T1_10) U9.38(BDBUS0)
UB: U2.AK15(IO_L5N_T0_10) U7.40(~{UB})
UTOF: U2.AF24(IO_L9N_T1_DQS_11) U3.62(PB9)
VSYNC: R10.1 U2.AJ19(IO_L17N_T2_11)
WE: U2.AD15(IO_L18N_T2_10) U7.17(~{WE})
NetC38_1: C38.1 C39.1 F3.1 U9.9(VPLL)
NetC42_1: C42.1 C43.1 F4.2 U9.4(VPHY)
NetC44_1: C44.1 U6.4(C2+)
NetC44_2: C44.2 U6.5(C2-)
NetC45_1: C45.1 U6.1(C1+)
NetC45_2: C45.2 U6.3(C1-)
NetC46_1: C46.1 U6.2(V+)
NetC48_1: C48.1 U6.6(V-)
NetC49_2: C49.2 U9.2(OSCI) Y2.1(OSC1)
NetC50_1: C50.1 U9.3(OSCO) Y2.2(OSC2)
NetC51_1: C51.1 D5.2(K) U8.1(VIN)
NetC54_1: C54.1 U1.17(3V3OUT)
NetC55_2: C55.2 L1.2 U8.4(FB)
NetC74_2: C74.2 U2.N16(VCCPINT) U2.P17(VCCPINT) U2.R18(VCCPINT) U2.T17(VCCPINT) U2.T19(VCCPINT) U2.U18(VCCPINT)
NetD1_2: D1.2(K) R13.1
NetD2_2: D2.2(K) R14.1
NetD3_1: D3.1(A) R27.1
NetD6_2: D6.2(K) U1.23(CBUS0)
NetD7_2: D7.2(K) U1.22(CBUS1)
NetD8_2: D8.2(K) L1.1 U8.2(OUT)
NetD9_2: D9.2(K) R52.1
NetF5_1: F5.1 USB1.1(VCC)
NetJ2_2: J2.2 U6.13(R1IN)
NetJ2_3: J2.3 U6.14(T1OUT)
NetLCD1_3: LCD1.3(VO) R42.3(TAP)
NetOSC1_1: OSC1.1(E/D) R50.1
NetP7_2: P7.2 S8.1(COMMON)
NetR1_1: R1.1 R2.1 R3.1 R4.1 VGA1.3
NetR8_1: R8.1 R9.1 R11.1 R12.1 VGA1.2
NetR15_1: R15.1 R16.1 R17.1 R18.1 VGA1.1
NetR22_1: R22.1 U2.P10(TDI_0)
NetR22_2: R22.2 U4.17(TDO)
NetR25_2: R25.2 R27.2 U2.AA9(DONE_0) U4.10(~{CE})
NetR26_2: R26.2 S7.1 U2.Y9(PROGRAM_B_0) U4.7(~{CF})
NetR32_1: R32.1 U2.Y12(TCK_0)
NetR34_1: R34.1 U2.V10(TMS_0)
NetR37_1: R37.1 U5.2(~{RE}) U5.3(DE)
NetR38_1: R38.1 R39.2
NetR40_1: R40.1 U5.6(A)
NetR41_1: R41.1 U5.7(B)
NetR43_1: R43.1 U9.7(DM)
NetR43_2: R43.2 USB1.2(D-)
NetR44_1: R44.1 U9.8(DP)
NetR44_2: R44.2 USB1.3(D+)
NetR45_1: R45.1 U9.14(RESET#)
NetR46_1: R46.1 U9.61(EEDATA) U11.3(DI)
NetR46_2: R46.2 R48.1 U11.4(DO)
NetR47_1: R47.1 U9.6(REF)
NetU1_15: U1.15(USBDP) USB2.3(D+)
NetU1_16: U1.16(USBDM) USB2.2(D-)
NetU9_62: U9.62(EECLK) U11.2(CLK)
NetU9_63: U9.63(EECS) U11.1(CS)

Not connected (* = marked no-connect by the designer): D5 1(A); D6 1(A); D7 1(A); J1 2* 3* 4* 7* 8* 9* 10(MH1)* 11(MH2)*; J2 1* 4* 5* 6* 7* 8* 9* 10(MH1)* 11(MH2)*; LCD1 7(D0)* 8(D1)* 9(D2)* 10(D3)*; P5 6* 7* 8*; R34 2; R49 2; R51 2; S8 2(NO); U1 2(DTR#)* 3(RTS#)* 6(RI#)* 8(NC)* 9(DSR#)* 10(DCD#)* 11(CTS#)* 12(CBUS4)* 13(CBUS2)* 14(CBUS3)* 19(RESET#)* 24(NC)* 27(OCSI)* 28(OCSO)*; U2 A2(IO_L24N_T3_33)* A3(IO_L24P_T3_33)* A4(IO_L21N_T3_DQS_33)* A5(IO_L21P_T3_DQS_33)* A6(VCCO_34)* A7(IO_L3N_T0_DQS_34)* A8(IO_L3P_T0_DQS_PUDC_B_34)* A9(IO_L2N_T0_34)* A10(IO_L1N_T0_34)* A12(IO_L24N_T3_AD15N_35)* A13(IO_L24P_T3_AD15P_35)* A14(IO_L23N_T3_35)* A15(IO_L21N_T3_DQS_AD14N_35)* A16(VCCO_35)* A17(IO_L18N_T2_AD13N_35)* A18(PS_MIO47_501)* A19(PS_MIO50_501)* A20(PS_MIO38_501)* A22(PS_CLK_500)* A23(PS_MIO11_500)* A24(PS_MIO9_500)* A25(PS_DDR_DQ0_502)* A26(VCCO_DDR_502)* A27(PS_DDR_DQ9_502)* A28(PS_DDR_DQ11_502)* A29(PS_DDR_DQ8_502)* A30(PS_DDR_DQ10_502)* AA2(MGTAVTT_1)* AA3(MGTXRXN3_111)* AA4(MGTXRXP3_111)* AA6(MGTAVCC_1)* AA7(MGTREFCLK0N_110)* AA8(MGTREFCLK0P_110)* AA18(IO_L13P_T2_MRCC_9)* AA19(IO_L13N_T2_MRCC_9)* AA20(IO_L6N_T0_VREF_9)* AB1(MGTXTXN0_111)* AB2(MGTXTXP0_111)* AB4(MGTAVTT_1)* AB5(MGTXRXN1_111)* AB6(MGTXRXP1_111)* AB8(MGTAVCC_1)* AB9(MGTRREF_112)* AB10(MGTAVTTRCAL_112)* AB19(IO_L14P_T2_SRCC_9)* AB20(IO_L14N_T2_SRCC_9)* AC2(MGTAVTT_1)* AC3(MGTXRXN0_111)* AC4(MGTXRXP0_111)* AC6(MGTAVCC_1)* AC7(MGTREFCLK1N_110)* AC8(MGTREFCLK1P_110)* AC10(MGTAVCC_1)* AC18(IO_L11P_T1_SRCC_9)* AC19(IO_L11N_T1_SRCC_9)* AC20(VCCO_9)* AC22(IO_L24P_T3_11) AD1(MGTXTXN3_110)* AD2(MGTXTXP3_110)* AD4(MGTAVTT_1)* AD5(MGTXRXN3_110)* AD6(MGTXRXP3_110)* AD8(MGTAVCC_1)* AD9(MGTREFCLK0N_109)* AD10(MGTREFCLK0P_109)* AD18(IO_L12P_T1_MRCC_9)* AD19(IO_L12N_T1_MRCC_9)* AD20(IO_L19P_T3_9)* AD21(IO_L10P_T1_11) AD23(IO_L11P_T1_SRCC_11) AE2(MGTAVTT_1)* AE3(MGTXTXN2_110)* AE4(MGTXTXP2_110)* AE6(MGTAVCC_1)* AE7(MGTXRXN3_109)* AE8(MGTXRXP3_109)* AE10(MGTAVCC_1)* AE20(IO_L19N_T3_VREF_9)* AE22(IO_L12P_T1_MRCC_11) AF1(MGTXTXN1_110)* AF2(MGTXTXP1_110)* AF4(MGTAVTT_1)* AF5(MGTXRXN2_110)* AF6(MGTXRXP2_110)* AF8(MGTAVCC_1)* AF9(MGTREFCLK1N_109)* AF10(MGTREFCLK1P_109)* AF22(IO_L12N_T1_MRCC_11) AG2(MGTAVTT_1)* AG3(MGTXRXN1_110)* AG4(MGTXRXP1_110)* AG6(MGTAVTT_1)* AG7(MGTXRXN2_109)* AG8(MGTXRXP2_109)* AG10(MGTAVCC_1)* AH1(MGTXTXN0_110)* AH2(MGTXTXP0_110)* AH4(MGTAVTT_1)* AH5(MGTXRXN0_110)* AH6(MGTXRXP0_110)* AH8(MGTAVCC_1)* AH9(MGTXRXN0_109)* AH10(MGTXRXP0_109)* AJ2(MGTAVTT_1)* AJ3(MGTXTXN2_109)* AJ4(MGTXTXP2_109)* AJ6(MGTAVTT_1)* AJ7(MGTXRXN1_109)* AJ8(MGTXRXP1_109)* AJ10(MGTAVCC_1)* AK1(MGTXTXN3_109)* AK2(MGTXTXP3_109)* AK4(MGTAVTT_1)* AK5(MGTXTXN1_109)* AK6(MGTXTXP1_109)* AK8(MGTAVTT_1)* AK9(MGTXTXN0_109)* AK10(MGTXTXP0_109)* B1(IO_L23N_T3_33)* B2(IO_L23P_T3_33)* B3(VCCO_33)* B4(IO_L20N_T3_33)* B5(IO_L20P_T3_33)* B6(IO_L5N_T0_34)* B7(IO_L4N_T0_34)* B9(IO_L2P_T0_34)* B10(IO_L1P_T0_34)* B11(IO_L22N_T3_AD7N_35)* B12(IO_L20N_T3_AD6N_35)* B13(VCCO_35)* B14(IO_L23P_T3_35)* B15(IO_L21P_T3_DQS_AD14P_35)* B16(IO_L17N_T2_AD5N_35)* B17(IO_L18P_T2_AD13P_35)* B19(PS_SRST_B_501)* B20(PS_MIO40_501)* B21(PS_MIO37_501)* B22(PS_MIO14_500)* B23(VCCO_MIO0_500)* B24(PS_MIO7_500)* B25(PS_DDR_DQ4_502)* B26(PS_DDR_DQS_N0_502)* B27(PS_DDR_DQ2_502)* B29(PS_DDR_DQS_N1_502)* B30(PS_DDR_DM1_502)* C1(IO_L22N_T3_33)* C2(IO_L22P_T3_33)* C3(IO_L19N_T3_VREF_33)* C4(IO_L19P_T3_33)* C6(IO_L5P_T0_34)* C7(IO_L4P_T0_34)* C8(IO_L6N_T0_VREF_34)* C9(IO_L6P_T0_34)* C10(VCCO_34)* C11(IO_L22P_T3_AD7P_35)* C12(IO_L20P_T3_AD6P_35)* C13(IO_L19N_T3_VREF_35)* C14(IO_L19P_T3_35)* C16(IO_L16N_T2_35)* C17(IO_L17P_T2_AD5P_35)* C18(PS_MIO53_501)* C19(PS_MIO48_501)* C20(VCCO_MIO1_501)* C21(PS_MIO8_500)* C22(PS_MIO15_500)* C23(PS_MIO3_500)* C24(PS_MIO5_500)* C26(PS_DDR_DQS_P0_502)* C27(PS_DDR_DM0_502)* C28(PS_DDR_DQ12_502)* C29(PS_DDR_DQS_P1_502)* C30(VCCO_DDR_502)* D1(IO_L18N_T2_33)* D3(IO_L16N_T2_33)* D4(IO_L16P_T2_33)* D5(IO_L15N_T2_DQS_33)* D6(IO_L17N_T2_34)* D7(VCCO_34)* D8(IO_L12N_T1_MRCC_34)* D9(IO_L12P_T1_MRCC_34)* D10(IO_L10N_T1_34)* D11(IO_L8N_T1_34)* D13(IO_L11N_T1_SRCC_35)* D14(IO_L14N_T2_AD4N_SRCC_35)* D15(IO_L14P_T2_AD4P_SRCC_35)* D16(IO_L16P_T2_35)* D17(VCCO_35)* D18(PS_MIO49_501)* D19(PS_MIO52_501)* D20(PS_MIO42_501)* D21(PS_POR_B_500)* D23(PS_MIO1_500)* D24(PS_MIO6_500)* D25(PS_DDR_DQ3_502)* D26(PS_DDR_DQ6_502)* D27(VCCO_DDR_502)* D28(PS_DDR_DQ14_502)* D29(PS_DDR_DQ15_502)* D30(PS_DDR_DQ13_502)* E1(IO_L18P_T2_33)* E2(IO_L17N_T2_33)* E3(IO_L17P_T2_33)* E4(VCCO_33)* E5(IO_L13N_T2_MRCC_33)* E6(IO_L15P_T2_DQS_33)* E7(IO_L17P_T2_34)* E8(IO_L14N_T2_SRCC_34)* E10(IO_L10P_T1_34)* E11(IO_L8P_T1_34)* E12(IO_L10N_T1_AD11N_35)* E13(IO_L11P_T1_SRCC_35)* E14(VCCO_35)* E15(IO_L13N_T2_MRCC_35)* E16(IO_L13P_T2_MRCC_35)* E17(IO_L15N_T2_DQS_AD12N_35)* E18(PS_MIO43_501)* E20(PS_MIO44_501)* E21(PS_MIO12_500)* E22(PS_MIO10_500)* E23(PS_MIO4_500)* E24(VCCO_MIO0_500)* E25(PS_DDR_DQ1_502)* E26(PS_DDR_DQ5_502)* E27(PS_DDR_DQ7_502)* E28(PS_DDR_DQ19_502)* E30(PS_DDR_DQ20_502)* F1(VCCO_33)* F2(IO_L7N_T1_33)* F3(IO_L14N_T2_SRCC_33)* F4(IO_L14P_T2_SRCC_33)* F5(IO_L13P_T2_MRCC_33)* F7(IO_L16N_T2_34)* F8(IO_L16P_T2_34)* F9(IO_L14P_T2_SRCC_34)* F10(IO_L11N_T1_SRCC_34)* F11(VCCO_34)* F12(IO_L9N_T1_DQS_AD3N_35)* F13(IO_L10P_T1_AD11P_35)* F14(IO_L12N_T1_MRCC_35)* F15(IO_L12P_T1_MRCC_35)* F17(IO_L15P_T2_DQS_AD12P_35)* F18(PS_MIO39_501)* F19(PS_MIO51_501)* F20(PS_MIO46_501)* F21(VCCO_MIO0_500)* F22(PS_MIO13_500)* F23(PS_MIO2_500)* F24(PS_MIO0_500)* F25(PS_DDR_DRST_B_502)* F27(PS_DDR_A8_502)* F28(PS_DDR_DQ21_502)* F29(PS_DDR_DQS_N2_502)* F30(PS_DDR_DQ23_502)* G1(IO_L10N_T1_33)* G2(IO_L7P_T1_33)* G4(IO_L12N_T1_MRCC_33)* G5(IO_L12P_T1_MRCC_33)* G6(IO_L8N_T1_33)* G7(IO_L18N_T2_34)* G8(VCCO_34)* G9(IO_L13N_T2_MRCC_34)* G10(IO_L11P_T1_SRCC_34)* G11(IO_L9N_T1_DQS_34)* G12(IO_L9P_T1_DQS_AD3P_35)* G14(IO_L8N_T1_AD10N_35)* G15(IO_L8P_T1_AD10P_35)* G16(IO_L7N_T1_AD2N_35)* G17(IO_L7P_T1_AD2P_35)* G18(VCCO_MIO1_501)* G19(PS_MIO25_501)* G20(PS_MIO27_501)* G21(PS_MIO35_501)* G22(PS_MIO33_501)* G24(PS_DDR_A5_502)* G25(PS_DDR_A3_502)* G26(PS_DDR_A10_502)* G27(PS_DDR_DQ17_502)* G28(VCCO_DDR_502)* G29(PS_DDR_DQS_P2_502)* G30(PS_DDR_DQ22_502)* H1(IO_L9N_T1_DQS_33)* H2(IO_L10P_T1_33)* H3(IO_L11N_T1_SRCC_33)* H4(IO_L11P_T1_SRCC_33)* H5(VCCO_33)* H6(IO_L8P_T1_33)* H7(IO_L18P_T2_34)* H8(IO_L15N_T2_DQS_34)* H9(IO_L13P_T2_MRCC_34)* H11(IO_L7N_T1_34)* H12(IO_L9P_T1_DQS_34)* H13(IO_L2N_T0_AD8N_35)* H14(IO_L4N_T0_35)* H15(VCCO_35)* H16(IO_L6N_T0_VREF_35)* H17(PS_MIO36_501)* H18(PS_MIO45_501)* H19(PS_MIO_VREF_501)* H21(PS_MIO31_501)* H22(PS_MIO29_501)* H23(PS_DDR_A13_502)* H24(PS_DDR_A11_502)* H25(VCCO_DDR_502)* H26(PS_DDR_A6_502)* H27(PS_DDR_DQ16_502)* H28(PS_DDR_DQ18_502)* H29(PS_DDR_DM2_502)* J1(IO_L9P_T1_DQS_33)* J2(VCCO_33)* J3(IO_L1N_T0_33)* J4(IO_L1P_T0_33)* J5(IO_L5N_T0_33)* J6(IO_L6N_T0_VREF_33)* J8(IO_L15P_T2_DQS_34)* J9(IO_L20N_T3_34)* J10(IO_L20P_T3_34)* J11(IO_L7P_T1_34)* J12(VCCO_34)* J13(IO_L2P_T0_AD8P_35)* J14(IO_L4P_T0_35)* J15(IO_L5N_T0_AD9N_35)* J16(IO_L6P_T0_35)* J18(PS_MIO41_501)* J19(PS_MIO21_501)* J20(PS_MIO19_501)* J21(PS_MIO23_501)* J22(VCCO_MIO1_501)* J23(PS_DDR_A9_502)* J24(PS_DDR_A14_502)* J25(PS_DDR_CKN_502)* J26(PS_DDR_A4_502)* J28(PS_DDR_DQ27_502)* J29(PS_DDR_DQ24_502)* J30(PS_DDR_DQ26_502)* K1(IO_L2N_T0_33)* K2(IO_L3N_T0_DQS_33)* K3(IO_L3P_T0_DQS_33)* K5(IO_L5P_T0_33)* K6(IO_L6P_T0_33)* K7(IO_L19N_T3_VREF_34)* K8(IO_L21N_T3_DQS_34)* K9(VCCO_34)* K10(IO_L22N_T3_34)* K11(IO_L22P_T3_34)* K12(IO_L24N_T3_34)* K13(IO_L3N_T0_DQS_AD1N_35)* K15(IO_L5P_T0_AD9P_35)* K16(IO_0_VRN_35)* K17(PS_MIO32_501)* K18(PS_MIO34_501)* K19(VCCO_MIO1_501)* K20(PS_MIO18_501)* K21(PS_MIO17_501)* K22(PS_DDR_A7_502)* K23(PS_DDR_A12_502)* K25(PS_DDR_CKP_502)* K26(PS_DDR_A1_502)* K27(PS_DDR_DQ25_502)* K28(PS_DDR_DM3_502)* K29(VCCO_DDR_502)* K30(PS_DDR_DQ28_502)* L1(IO_L2P_T0_33)* L2(IO_L4N_T0_33) L3(IO_L4P_T0_33)* L4(IO_25_VRP_33)* L5(IO_0_VRN_33)* L6(VCCO_33)* L7(IO_L19P_T3_34)* L8(IO_L21P_T3_DQS_34)* L9(IO_L23N_T3_34)* L10(IO_L23P_T3_34)* L12(IO_L24P_T3_34)* L13(IO_L3P_T0_DQS_AD1P_35)* L14(IO_L1N_T0_AD0N_35)* L15(IO_L1P_T0_AD0P_35)* L16(VCCO_35)* L17(PS_MIO28_501)* L18(PS_MIO30_501)* L19(PS_MIO16_501)* L20(PS_MIO22_501)* L22(PS_DDR_VREF0_502)* L23(PS_DDR_ODT_502)* L24(PS_DDR_VREF1_502)* L25(PS_DDR_A0_502)* L26(VCCO_DDR_502)* L27(PS_DDR_A2_502)* L28(PS_DDR_DQS_P3_502)* L29(PS_DDR_DQS_N3_502)* L30(PS_DDR_DQ30_502)* M10(IO_25_VRP_34)* M12(IO_0_VRN_34)* M16(IO_25_VRP_35)* M17(PS_MIO26_501)* M19(PS_MIO24_501)* M20(PS_MIO20_501)* M21(PS_DDR_VRP_502)* M22(PS_DDR_CKE_502)* M23(VCCO_DDR_502)* M24(PS_DDR_CAS_B_502)* M25(PS_DDR_BA2_502)* M26(PS_DDR_BA1_502)* M27(PS_DDR_BA0_502)* M29(PS_DDR_DQ29_502)* M30(PS_DDR_DQ31_502)* N2(MGTAVTT_1)* N3(MGTXTXN3_112)* N4(MGTXTXP3_112)* N6(MGTAVCC_1)* N7(MGTREFCLK0N_112)* N8(MGTREFCLK0P_112)* N18(VCCPLL)* N21(PS_DDR_VRN_502)* N22(PS_DDR_CS_B_502)* N23(PS_DDR_WE_B_502)* N24(PS_DDR_RAS_B_502)* N26(IO_L15P_T2_DQS_13)* N27(IO_L15N_T2_DQS_13)* N28(IO_L3P_T0_DQS_13)* N29(IO_L4P_T0_13)* N30(VCCO_13)* P1(MGTXTXN2_112)* P2(MGTXTXP2_112)* P4(MGTAVTT_1)* P5(MGTXRXN3_112)* P6(MGTXRXP3_112)* P8(MGTAVCC_1)* P14(GNDADC_0)* P15(VCCADC_0)* P21(IO_L19P_T3_13)* P23(IO_L18P_T2_13)* P24(IO_L18N_T2_13)* P25(IO_L16P_T2_13)* P26(IO_L16N_T2_13)* P27(VCCO_13)* P28(IO_L3N_T0_DQS_13)* P29(IO_L4N_T0_13)* P30(IO_L1P_T0_13)* R2(MGTAVTT_2)* R3(MGTXTXN1_112)* R4(MGTXTXP1_112)* R6(MGTAVCC_1)* R7(MGTREFCLK1N_112)* R8(MGTREFCLK1P_112)* R21(IO_L19N_T3_VREF_13)* R22(IO_L21P_T3_DQS_13)* R23(IO_L21N_T3_DQS_13)* R24(VCCO_13)* R25(IO_L13P_T2_MRCC_13)* R26(IO_L13N_T2_MRCC_13)* R27(IO_L14P_T2_SRCC_13)* R28(IO_L6P_T0_13)* R30(IO_L1N_T0_13)* T1(MGTXTXN0_112)* T2(MGTXTXP0_112)* T4(MGTAVTT_2)* T5(MGTXRXN2_112)* T6(MGTXRXP2_112)* T7(MGTVCCAUX)* T21(VCCO_13)* T22(IO_L20P_T3_13)* T23(IO_L20N_T3_13)* T24(IO_L17P_T2_13)* T25(IO_L17N_T2_13)* T27(IO_L14N_T2_SRCC_13)* T28(IO_L6N_T0_VREF_13)* T29(IO_L5P_T0_13)* T30(IO_L2P_T0_13)* U2(MGTAVTT_2)* U3(MGTXRXN1_112)* U4(MGTXRXP1_112)* U6(MGTAVCC_1)* U7(MGTREFCLK0N_111)* U8(MGTREFCLK0P_111)* U14(DXN_0)* U15(DXP_0)* U21(IO_0_13)* U22(IO_L22P_T3_13)* U24(IO_L23P_T3_13)* U25(IO_L11P_T1_SRCC_13)* U26(IO_L12P_T1_MRCC_13)* U27(IO_L12N_T1_MRCC_13)* U28(VCCO_13)* U29(IO_L5N_T0_13)* U30(IO_L2N_T0_13)* V1(MGTXTXN3_111)* V2(MGTXTXP3_111)* V4(MGTAVTT_2)* V5(MGTXRXN0_112)* V6(MGTXRXP0_112)* V7(MGTVCCAUX)* V21(IO_25_13)* V22(IO_L22N_T3_13)* V23(IO_L24P_T3_13)* V24(IO_L23N_T3_13)* V25(VCCO_13)* V26(IO_L11N_T1_SRCC_13)* V27(IO_L9P_T1_DQS_13)* V28(IO_L7P_T1_13)* V29(IO_L7N_T1_13)* W2(MGTAVTT_2)* W3(MGTXTXN2_111)* W4(MGTXTXP2_111)* W6(MGTAVCC_2)* W7(MGTREFCLK1N_111)* W8(MGTREFCLK1P_111)* W24(IO_L24N_T3_13)* W25(IO_L10P_T1_13)* W26(IO_L10N_T1_13)* W28(IO_L9N_T1_DQS_13)* W29(IO_L8P_T1_13)* W30(IO_L8N_T1_13)* Y1(MGTXTXN1_111)* Y2(MGTXTXP1_111)* Y4(MGTAVTT_2)* Y5(MGTXRXN2_111)* Y6(MGTXRXP2_111)* Y8(MGTAVCC_2)* Y19(VCCO_9)* Y20(IO_L6P_T0_9)*; U4 2(DNC)* 9(DNC)* 12(DNC)* 13(~{CE}~{O})* 14(DNC)* 15(DNC)* 16(DNC)*; U6 7(T2OUT)* 8(R2IN)* 9(R2OUT)* 10(T2IN)*; U7 28(NC)*; U9 21(ADBUS4)* 22(ADBUS5)* 23(ADBUS6)* 24(ADBUS7)* 26(ACBUS0)* 27(ACBUS1)* 28(ACBUS2)* 29(ACBUS3)* 30(ACBUS4)* 32(ACBUS5)* 33(ACBUS6)* 34(ACBUS7)* 36(SUSPEND#)* 40(BDBUS2)* 41(BDBUS3)* 43(BDBUS4)* 44(BDBUS5)* 45(BDBUS6)* 46(BDBUS7)* 48(BCBUS0)* 52(BCBUS1)* 53(BCBUS2)* 54(BCBUS3)* 55(BCBUS4)* 57(BCBUS5)* 58(BCBUS6)* 59(BCBUS7)* 60(PWREN#)*; U11 6(NC)* 7(NC)*; USB1 4(NC)*; USB2 1(VCC)* 4(NC)*; VGA1 4* 9* 12* 13 14 15* 16(MH1)* 17(MH2)*; VR2 1(GND); VR3 1(GND); VR4 1(GND)

## Notes on the sheet
- (near VGA1) VGA PORT
- FPGA's supply voltages
- Flash2Memory
- PUSH BUTTON
- ZYNQ 7000 FPGA I/O BANKS
- EEPROMI2C
- RS485
- (near P2) Micro Controller-ARM CORTEX M3
- (near U2) ZYNQ 7000 FPGA GND
- (near U7) RAM-IS61LV25616AL
- LCD
- I/O
- (near U2) ZYNQ 7000 FPGA VCC
- UART
- (near P5) JTAG
- DIP SWITCH
- (near R50) OSCILLATOR-50M
- ZYNQ 7000 FPGA NC PARTS
- Labels drawn without touching a wire or pin: GND
- (in symbol Voltage Regulator) LD117DT33
- (in symbol Voltage_Reg_Fan) FAN1112D-1.8

## Library data of the parts
C1-C4 = Cap Pol2_1: Polarized Capacitor (Axial); Published: 8-Jun-2000; LatestRevisionDate: 17-Jul-2002; LatestRevisionNote: Re-released for DXP Platform.; PackageReference: POLAR0.8; Publisher: Altium Limited; PackageDescription: Polarized Capacitor; 2 Leads
C5-C43 C47 C49-C74 = Cap: Capacitor; Published: 8-Jun-2000; LatestRevisionDate: 17-Jul-2002; LatestRevisionNote: Re-released for DXP Platform.; PackageReference: RAD-0.3; Publisher: Altium Limited; PackageDescription: Radial Cap, Thru-Hole; 2 Leads; 0.3 in Pin Spacing
C44-C46 C48 = Cap Pol2: Polarized Capacitor (Axial); Published: 8-Jun-2000; LatestRevisionDate: 17-Jul-2002; LatestRevisionNote: Re-released for DXP Platform.; PackageReference: POLAR0.8; Publisher: Altium Limited; PackageDescription: Polarized Capacitor; 2 Leads
D1-D3 D6 D7 D9 = LED0: Typical INFRARED GaAs LED; Published: 8-Jun-2000; LatestRevisionDate: 08-Jul-2005; LatestRevisionNote: Mech Layer 1 removed.; PackageReference: LED-0; Publisher: Altium Limited; PackageDescription: LED; 2 Leads
D4 = CDSOT23-SM712: 26V, 14V Clamp 17A (8/20Âµs) Ipp Tvs Diode Surface Mount SOT-23-3; MF: Bourns; Check_prices: https://www.snapeda.com/parts/CDSOT23-SM712/Bourns+-+J.W.+Miller/view-part/?ref=eda; Value: *; Availability: In Stock; MP: CDSOT23-SM712; Price: None; Package: SOT-23 Bourns; SnapEDA_Link: https://www.snapeda.com/parts/CDSOT23-SM712/Bourns+-+J.W.+Miller/view-part/?ref=snap; Purchase-URL: https://pricing.snapeda.com/search/part/CDSOT23-SM712/?ref=eda
D5 = Diode 1N4001: 1 Amp General Purpose Rectifier; Published: 8-Jun-2000; LatestRevisionDate: 17-Jul-2002; LatestRevisionNote: Re-released for DXP Platform.; DatasheetVersion: 1998; PackageVersion: Aug-1999; PackageReference: DO-41; Publisher: Altium Limited; PackageDescription: Diode, Axial; Body 5.2 x 2.7 mm (LxDia. max), Lead Dia. 0.86 mm (max); Code_JEDEC: DO-204-AL; ComponentLink1Description: Manufacturer Link; ComponentLink1URL: http://www.fairchildsemi.com/; ComponentLink2Description: Datasheet; ComponentLink2URL: http://www.fairchildsemi.com/ds/1N%2F1N4001.pdf
D8 = Diode 11DQ03: Schottky Rectifier; Published: 8-Jun-2000; LatestRevisionDate: 17-Jul-2002; LatestRevisionNote: Re-released for DXP Platform.; DatasheetVersion: Dec-1997; PackageReference: DO-204AL; Publisher: Altium Limited; PackageDescription: Diode, Axial; Body 5.2 x 2.7 mm (LxDia. max), Lead Dia. 0.86 mm (max); Code_JEDEC: DO-204-AL; ComponentLink1Description: Manufacturer Link; ComponentLink1URL: http://www.irf.com/; ComponentLink2Description: Datasheet; ComponentLink2URL: http://www.irf.com/product-info/datasheets/data/11dq03.pdf
F1-F5 = Inductor: Code_IEC: 1005; Value: 10mH; Published: 8-Jun-2000; LatestRevisionDate: 29-May-2009; LatestRevisionNote: IPC-7351 Footprint Added.; PackageReference: 0402-A; Publisher: Altium Limited; PackageDescription: Chip Inductor; Code_JEITA: 0402
J1 J2 = D Connector 9: Receptacle Assembly, 9 Position, Right Angle; PackageDocument: O; Positions: 9; Published: 15-Jun-2001; LatestRevisionDate: 17-Jul-2002; LatestRevisionNote: Re-released for DXP Platform.; DatasheetDocument: 1-Sep-1999; PackageReference: 788750; Publisher: Altium Limited; Orientation: Right Angle; Gender: Receptacle
L1 = Inductor_1: Code_IEC: 1005; Published: 8-Jun-2000; LatestRevisionDate: 29-May-2009; LatestRevisionNote: IPC-7351 Footprint Added.; PackageReference: 0402-A; Publisher: Altium Limited; PackageDescription: Chip Inductor; Code_JEITA: 0402
OSC1 = OSC_SMD: Designer:: Mohammad Ansari
P1 = Header 5: Header, 5-Pin; LatestRevisionDate: 17-Jul-2002; LatestRevisionNote: Re-released for DXP Platform.; Publisher: Altium Limited
P2 = Header 9X2: Header, 9-Pin, Dual row; LatestRevisionDate: 17-Jul-2002; LatestRevisionNote: Re-released for DXP Platform.; Publisher: Altium Limited
P3 P4 = Header 15X2: Header, 15-Pin, Dual row; LatestRevisionDate: 17-Jul-2002; LatestRevisionNote: Re-released for DXP Platform.; Publisher: Altium Limited
P5 = Header 5X2H: Header, 5-Pin, Dual row, Right Angle; LatestRevisionDate: 17-Jul-2002; LatestRevisionNote: Re-released for DXP Platform.; Publisher: Altium Limited
P6 = Header 9: Header, 9-Pin; LatestRevisionDate: 17-Jul-2002; LatestRevisionNote: Re-released for DXP Platform.; Publisher: Altium Limited
P7 = Header 2: Header, 2-Pin; LatestRevisionDate: 17-Jul-2002; LatestRevisionNote: Re-released for DXP Platform.; Publisher: Altium Limited
R1-R41 R43-R52 = Res1: Resistor; Published: 8-Jun-2000; LatestRevisionDate: 17-Jul-2002; LatestRevisionNote: Re-released for DXP Platform.; PackageReference: AXIAL-0.3; Publisher: Altium Limited; PackageDescription: Axial Device, Thru-Hole; 2 Leads; 0.3 in Pin Spacing
R42 = RPot: Potentiometer; Sim Note: Enter the Resistance value and the set point into parameter fields.; Set Position: 0.5; Published: 8-Jun-2000; LatestRevisionDate: 17-Jul-2002; LatestRevisionNote: Re-released for DXP Platform.; PackageReference: VR5; Publisher: Altium Limited; PackageDescription: Variable Resistor, Thru-Hole; 3 Leads
S1-S4 S6 S7 = SW-PB: Switch; Published: 24-Mar-1999; LatestRevisionDate: 17-Jul-2002; LatestRevisionNote: Re-released for DXP Platform.; PackageReference: SPST-2; Publisher: Altium Limited; PackageDescription: Switch; 2 Leads
S5 S8 = SW-SPST: Single-Pole, Single-Throw Switch; Published: 24-Mar-1999; LatestRevisionDate: 17-Jul-2002; LatestRevisionNote: Re-released for DXP Platform.; PackageReference: SPST-2; Publisher: Altium Limited; PackageDescription: Switch; 2 Leads
S9 = SW DIP-8: DIP Switch, 8 Position, SPST; Published: 24-Mar-1999; LatestRevisionDate: 17-Jul-2002; LatestRevisionNote: Re-released for DXP Platform.; PackageReference: DIP_SW_8WAY_SMD; Publisher: Altium Limited; PackageDescription: DIP Switch; 16 Leads
U2 = XC7Z045-2FFG900I: Dual ARMÂ® CortexÂ®-A9 MPCoreâ„¢ with CoreSightâ„¢ System On Chip (SOC) IC ZynqÂ®-7000 Kintexâ„¢-7 FPGA, 350K Logic Cells 800MHz 900-FCBGA (31x31); MF: Xilinx Inc.; Check_prices: https://www.snapeda.com/parts/XC7Z045-2FFG900I/Xilinx+Inc./view-part/?ref=eda; SnapEDA_Link: https://www.snapeda.com/parts/XC7Z045-2FFG900I/Xilinx+Inc./view-part/?ref=snap; Price: None; Purchase-URL: https://pricing.snapeda.com/search/part/XC7Z045-2FFG900I/?ref=eda; Package: BBGA-900 Xilinx; Availability: In Stock; Value: *; MP: XC7Z045-2FFG900I
U3 = STM32F103RBT6: ARMÂ® CortexÂ®-M3 STM32F1 Microcontroller IC 32-Bit 72MHz 128KB (128K x 8) FLASH 64-LQFP (10x10); MF: STMicroelectronics; Package: LQFP-64 STMicroelectronics; Price: None; Check_prices: https://www.snapeda.com/parts/STM32F103RBT6/STMicroelectronics/view-part/?ref=eda; Value: *; SnapEDA_Link: https://www.snapeda.com/parts/STM32F103RBT6/STMicroelectronics/view-part/?ref=snap; MP: STM32F103RBT6; Availability: In Stock; Purchase-URL: https://pricing.snapeda.com/search?q=STM32F103RBT6&ref=eda
U4 = XCF02SVO20C: Mfr_Name: Xilinx Inc; RefDes: RefDes; Type: Type
U5 = MAX485ESA+T: 1/1 Transceiver Half RS422, RS485 8-SOIC; MF: Maxim Integrated; MP: MAX485ESA; SnapEDA_Link: https://www.snapeda.com/parts/MAX485ESA/Maxim+Integrated/view-part/?ref=snap; Purchase-URL: https://pricing.snapeda.com/search/part/MAX485ESA/?ref=eda; Value: *; Package: SOIC-8 Maxim; Price: None; Availability: In Stock; Check_prices: https://www.snapeda.com/parts/MAX485ESA/Maxim+Integrated/view-part/?ref=eda
U6 = MAX3232CPE: 3.0V TO 5.5V, Low-Power, up to 1Mbps, True RS-232 Transceiver Using Four 0.1µF External Capacitor; Published: 16-Jan-2001; LatestRevisionDate: 29-May-2009; LatestRevisionNote: Component Body Added.; DatasheetVersion: Mar-1999; PackageVersion: Aug-2000; PackageReference: PE16; Publisher: Altium Limited; PackageDescription: DIP, 16-Pin, Row Spacing 7.62 mm, Pitch 2.54 mm; Code_JEDEC: MS-001-BB; ComponentLink1Description: Manufacturer Link; ComponentLink1URL: http://www.maxim-ic.com/; ComponentLink2Description: Datasheet; ComponentLink2URL: http://pdfserv.maxim-ic.com/en/ds/MAX3222-MAX3241.pdf
U8 = LM2576HVT-5.0LF03: No Description Available; Mfr_Name: Texas Instruments; RefDes: RefDes; Type: Type
U9 = FT2232HL-Reel: Dual High Speed USB To Multipurpose UART/FIFO IC, 64-pin LQFP, Tape and Reel; Manufacturer: FTDI; DatasheetVersion: ver 2.21, Jun-2012; PackageVersion: Jun-12; PackageReference: LQFP-64; PackageDescription: 64-Pin Thin Quad Flat Pack, 10 x 10 x 1.4 mm Body, 0.5 mm Pitch; PartNumber: FT2232HL-Reel; ComponentLink1Description: Manufacturer URL; ComponentLink1URL: http://www.ftdichip.com/; ComponentLink2Description: Datasheet; ComponentLink2URL: http://www.ftdichip.com/Support/Documents/DataSheets/ICs/DS_FT2232H.pdf
U11 = 93LC46A-E/SN: 1K, 128x8-bit, 2.5V Microwire Serial EEPROM, 8-Pin SOIC 150mil, Extended Temperature; Published: 29-Jan-2009; DatasheetVersion: revG, May-2008; PackageVersion: revAW, Oct-2008; PackageReference: SOIC-SN8; Publisher: Altium Limited; PackageDescription: 8-Lead Plastic Small Outline (SN) - Narrow, 3.90mm Body [SOIC]; Code_JEDEC: MS-012; Code_IPC: SOIC127P600-8; ComponentLink1Description: Manufacturer Link; ComponentLink1URL: http://www.microchip.com; ComponentLink2Description: Datasheet; ComponentLink2URL: http://ww1.microchip.com/downloads/en/DeviceDoc/21749G.pdf; ComponentLink3Description: Packaging Specification; ComponentLink3URL: http://ww1.microchip.com/downloads/en/PackagingSpec/00049AW.pdf
VGA1 = Connector 15: Receptacle Assembly, 15-Pin, Sim Line Connector; PackageDocument: B; Positions: 15; Gender: Receptacle Header; Published: 15-Jun-2001; LatestRevisionDate: 17-Jul-2002; LatestRevisionNote: Re-released for DXP Platform.; DatasheetDocument: 24-Nov-1999; PackageReference: 788574; Publisher: Altium Limited; Orientation: Right Angle
Y1 = XTAL_1: Crystal Oscillator; Published: 8-Jun-2000; LatestRevisionDate: 17-Jul-2002; LatestRevisionNote: Re-released for DXP Platform.; PackageReference: R38; Publisher: Altium Limited; PackageDescription: Crystal, Thru-Hole; 2 Leads; Body 3.1 x 8.2 mm (Dia.xH)
Y2 = XTAL: Crystal Oscillator; Published: 8-Jun-2000; LatestRevisionDate: 17-Jul-2002; LatestRevisionNote: Re-released for DXP Platform.; PackageReference: R38; Publisher: Altium Limited; PackageDescription: Crystal, Thru-Hole; 2 Leads; Body 3.1 x 8.2 mm (Dia.xH)